# Altium schematic sheet UC3842测试分析.SchDoc
size 1651 x 1651 mm; SheetNumber: 13; SheetTotal: 16
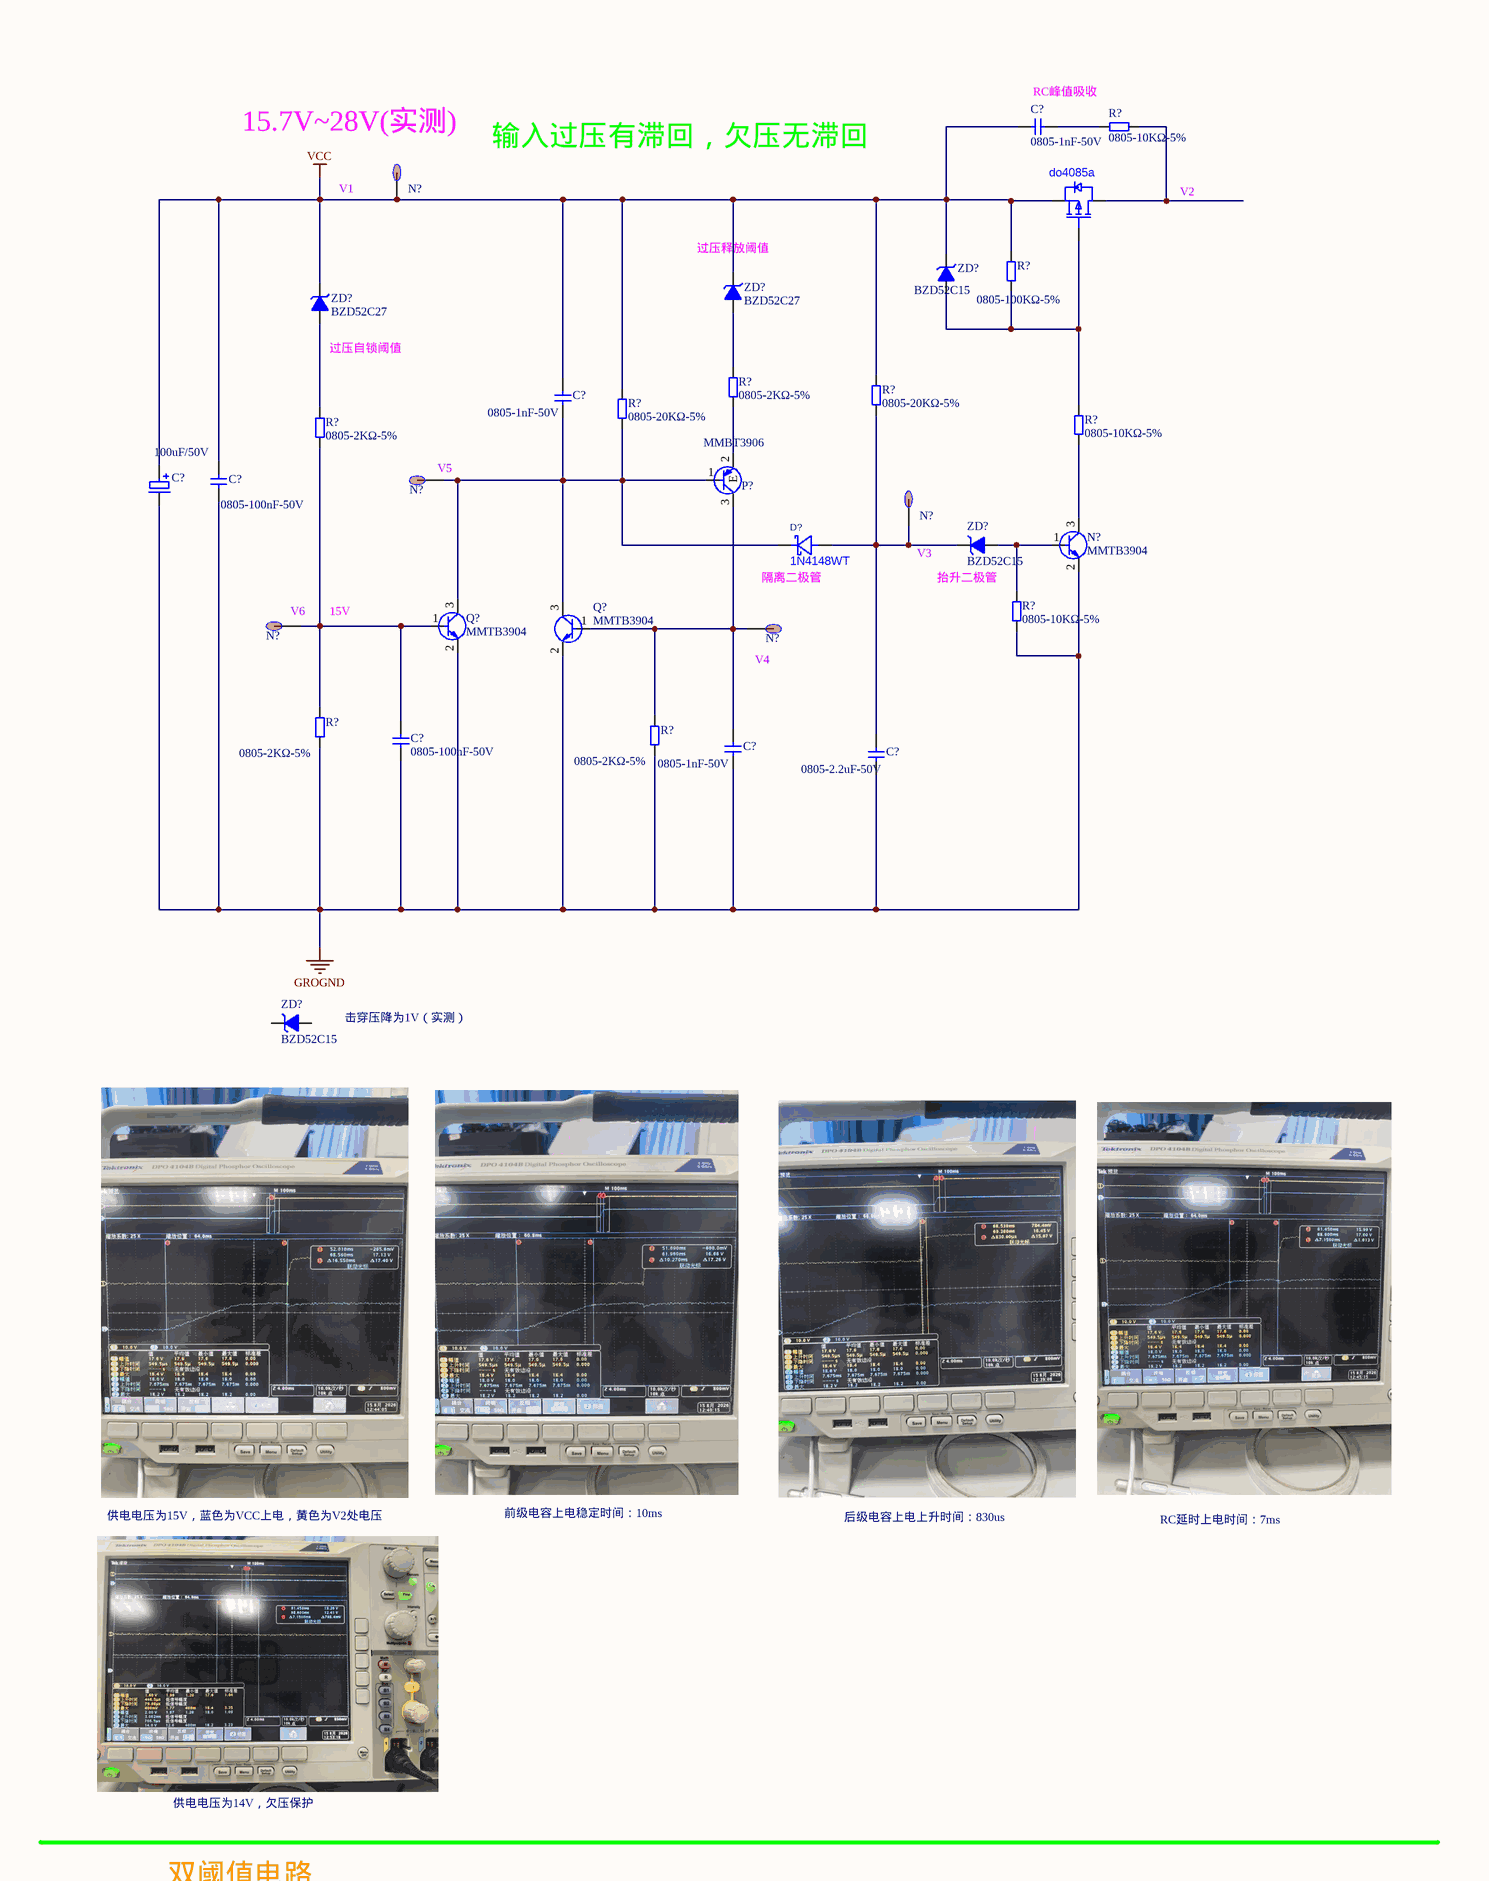
[diagram p0: UC3842测试分析.SchDoc, row 1 of 4 left]
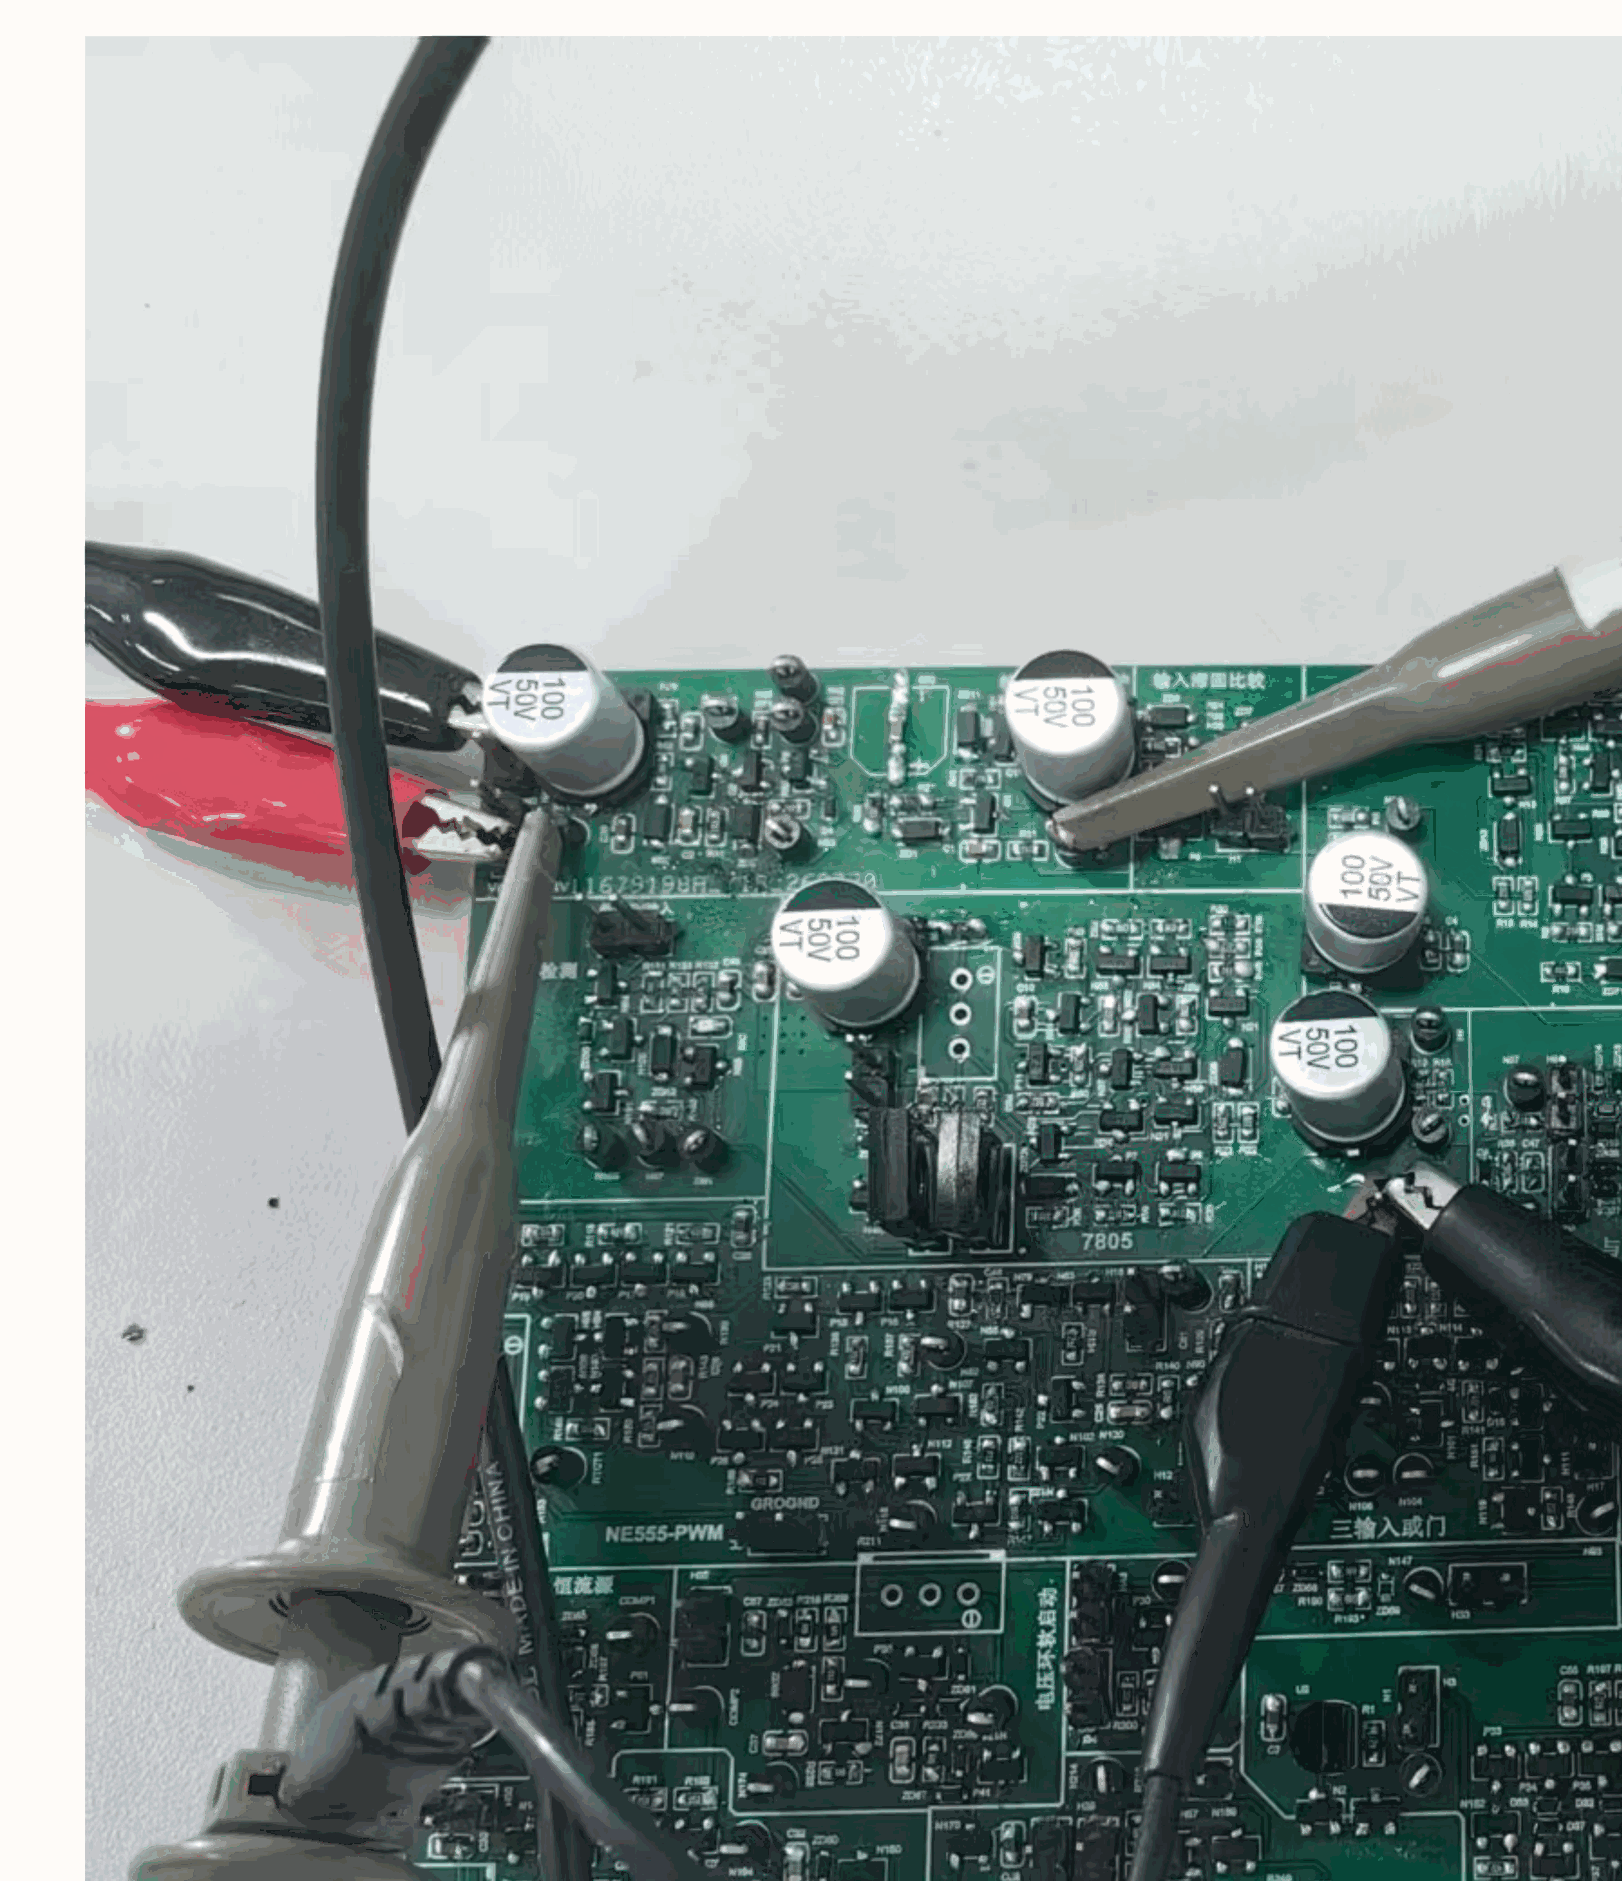
[diagram p1: UC3842测试分析.SchDoc, row 1 of 4 middle]
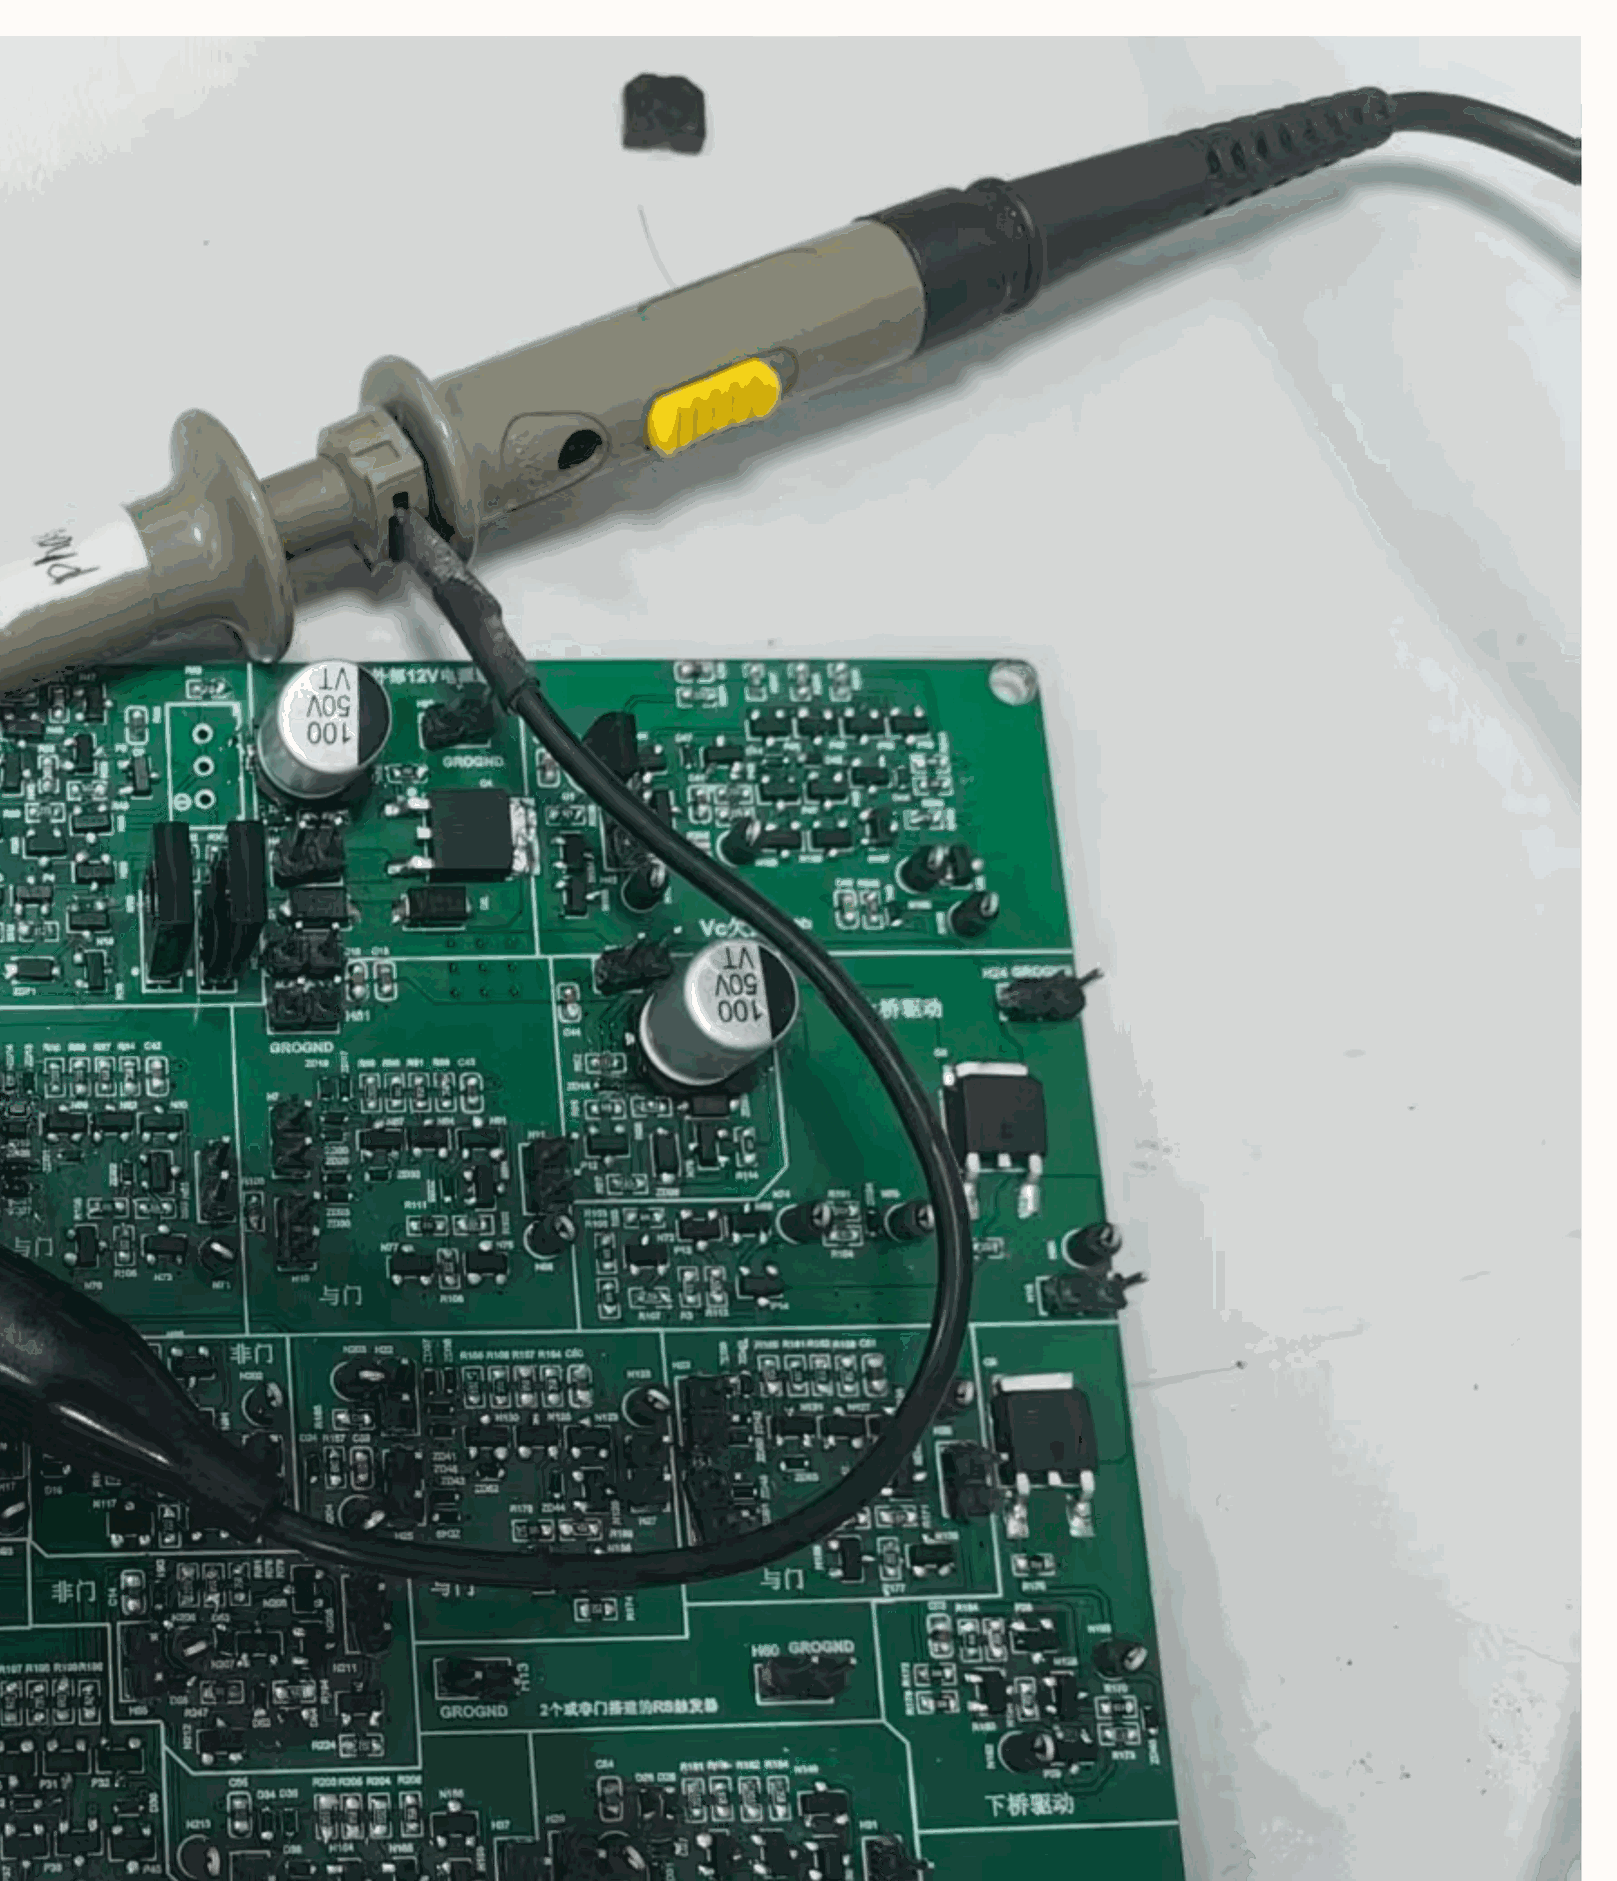
[diagram p2: UC3842测试分析.SchDoc, row 1 of 4 right]
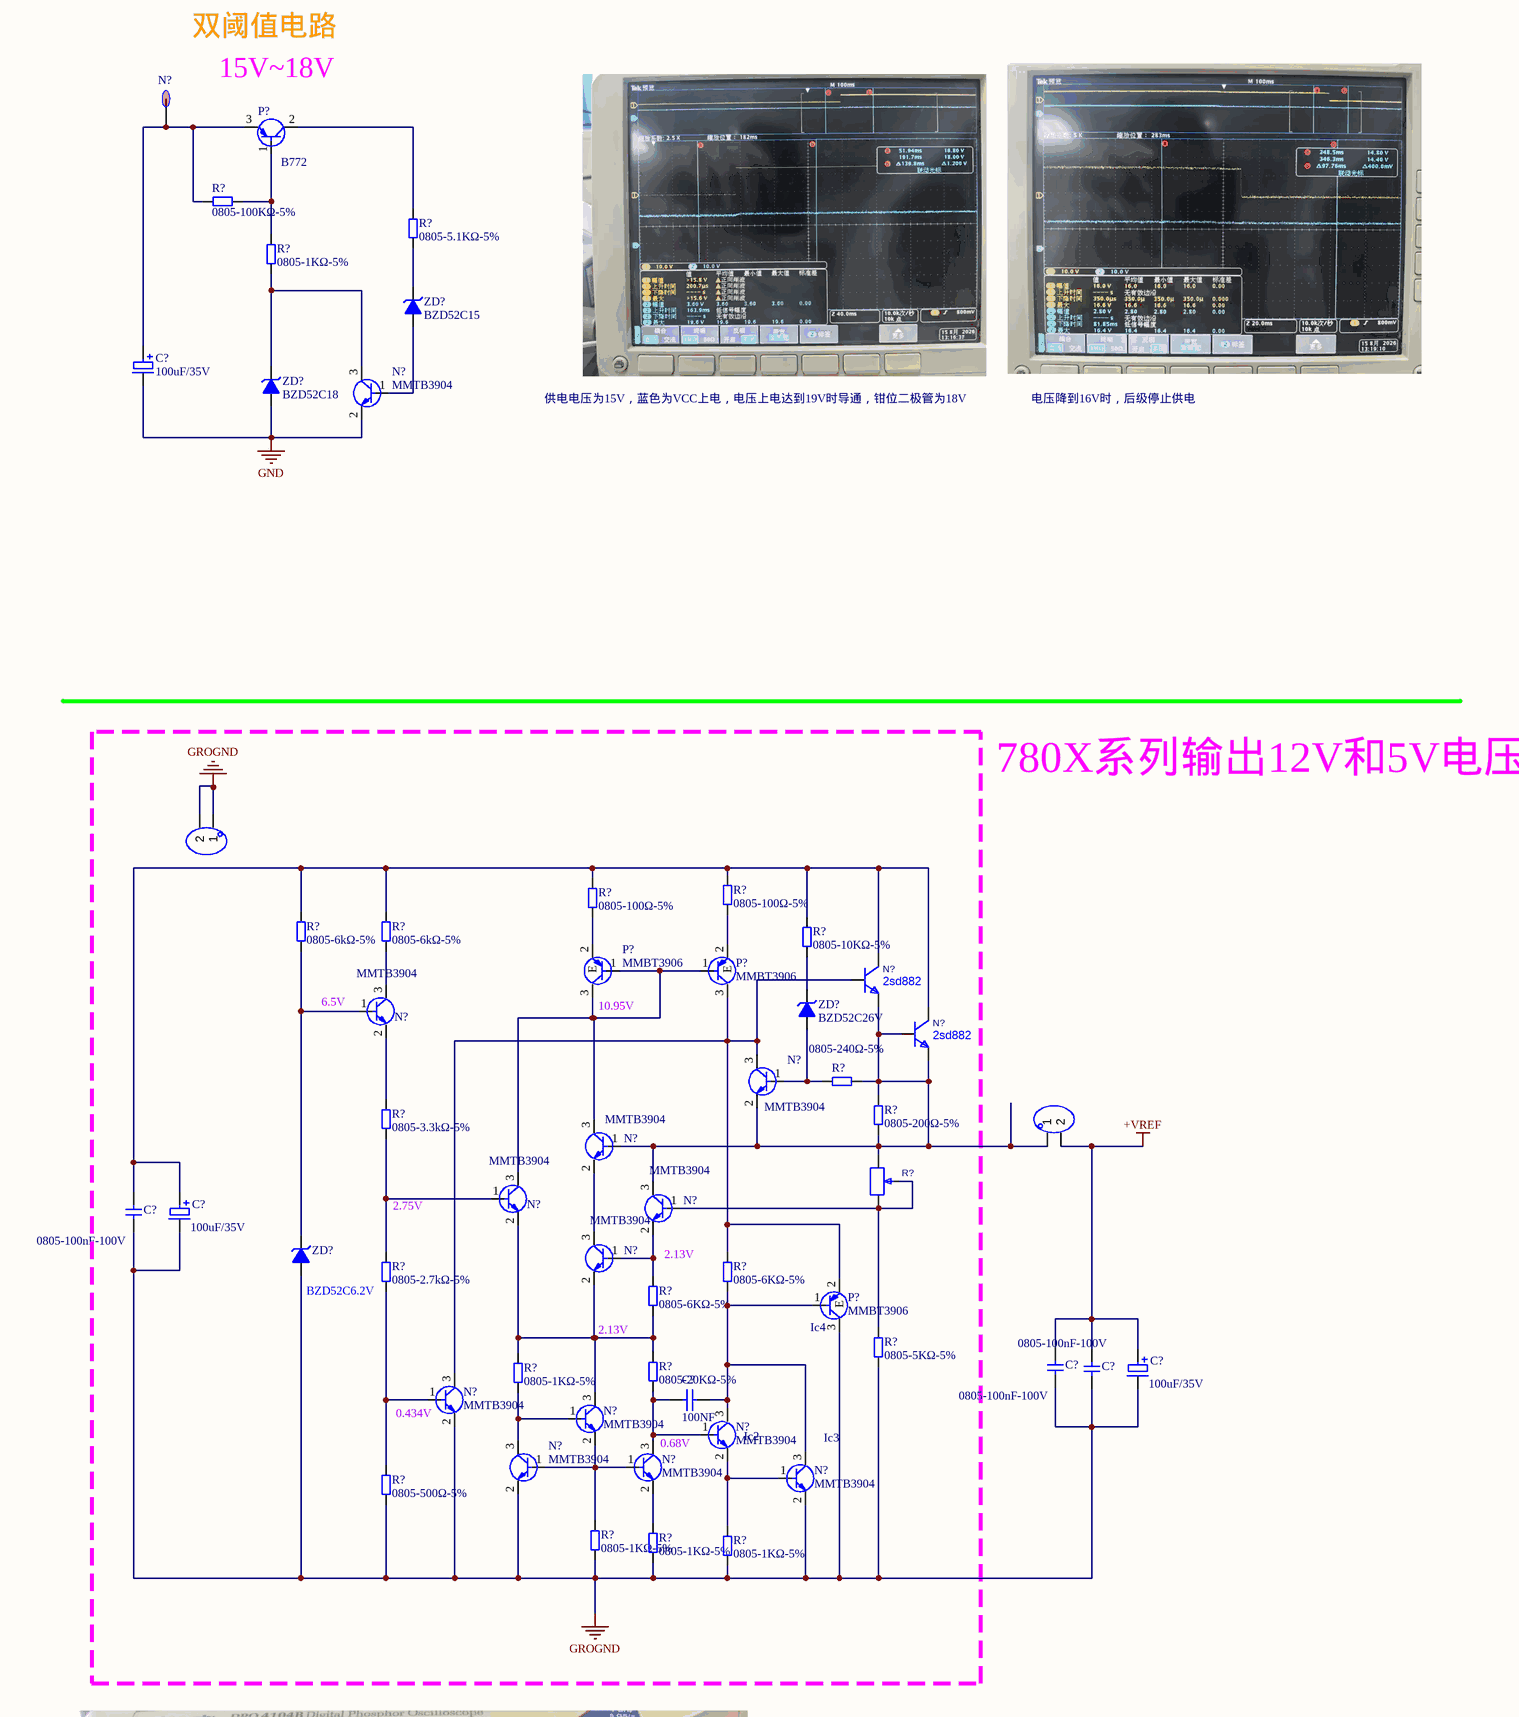
[diagram p3: UC3842测试分析.SchDoc, row 2 of 4 left]
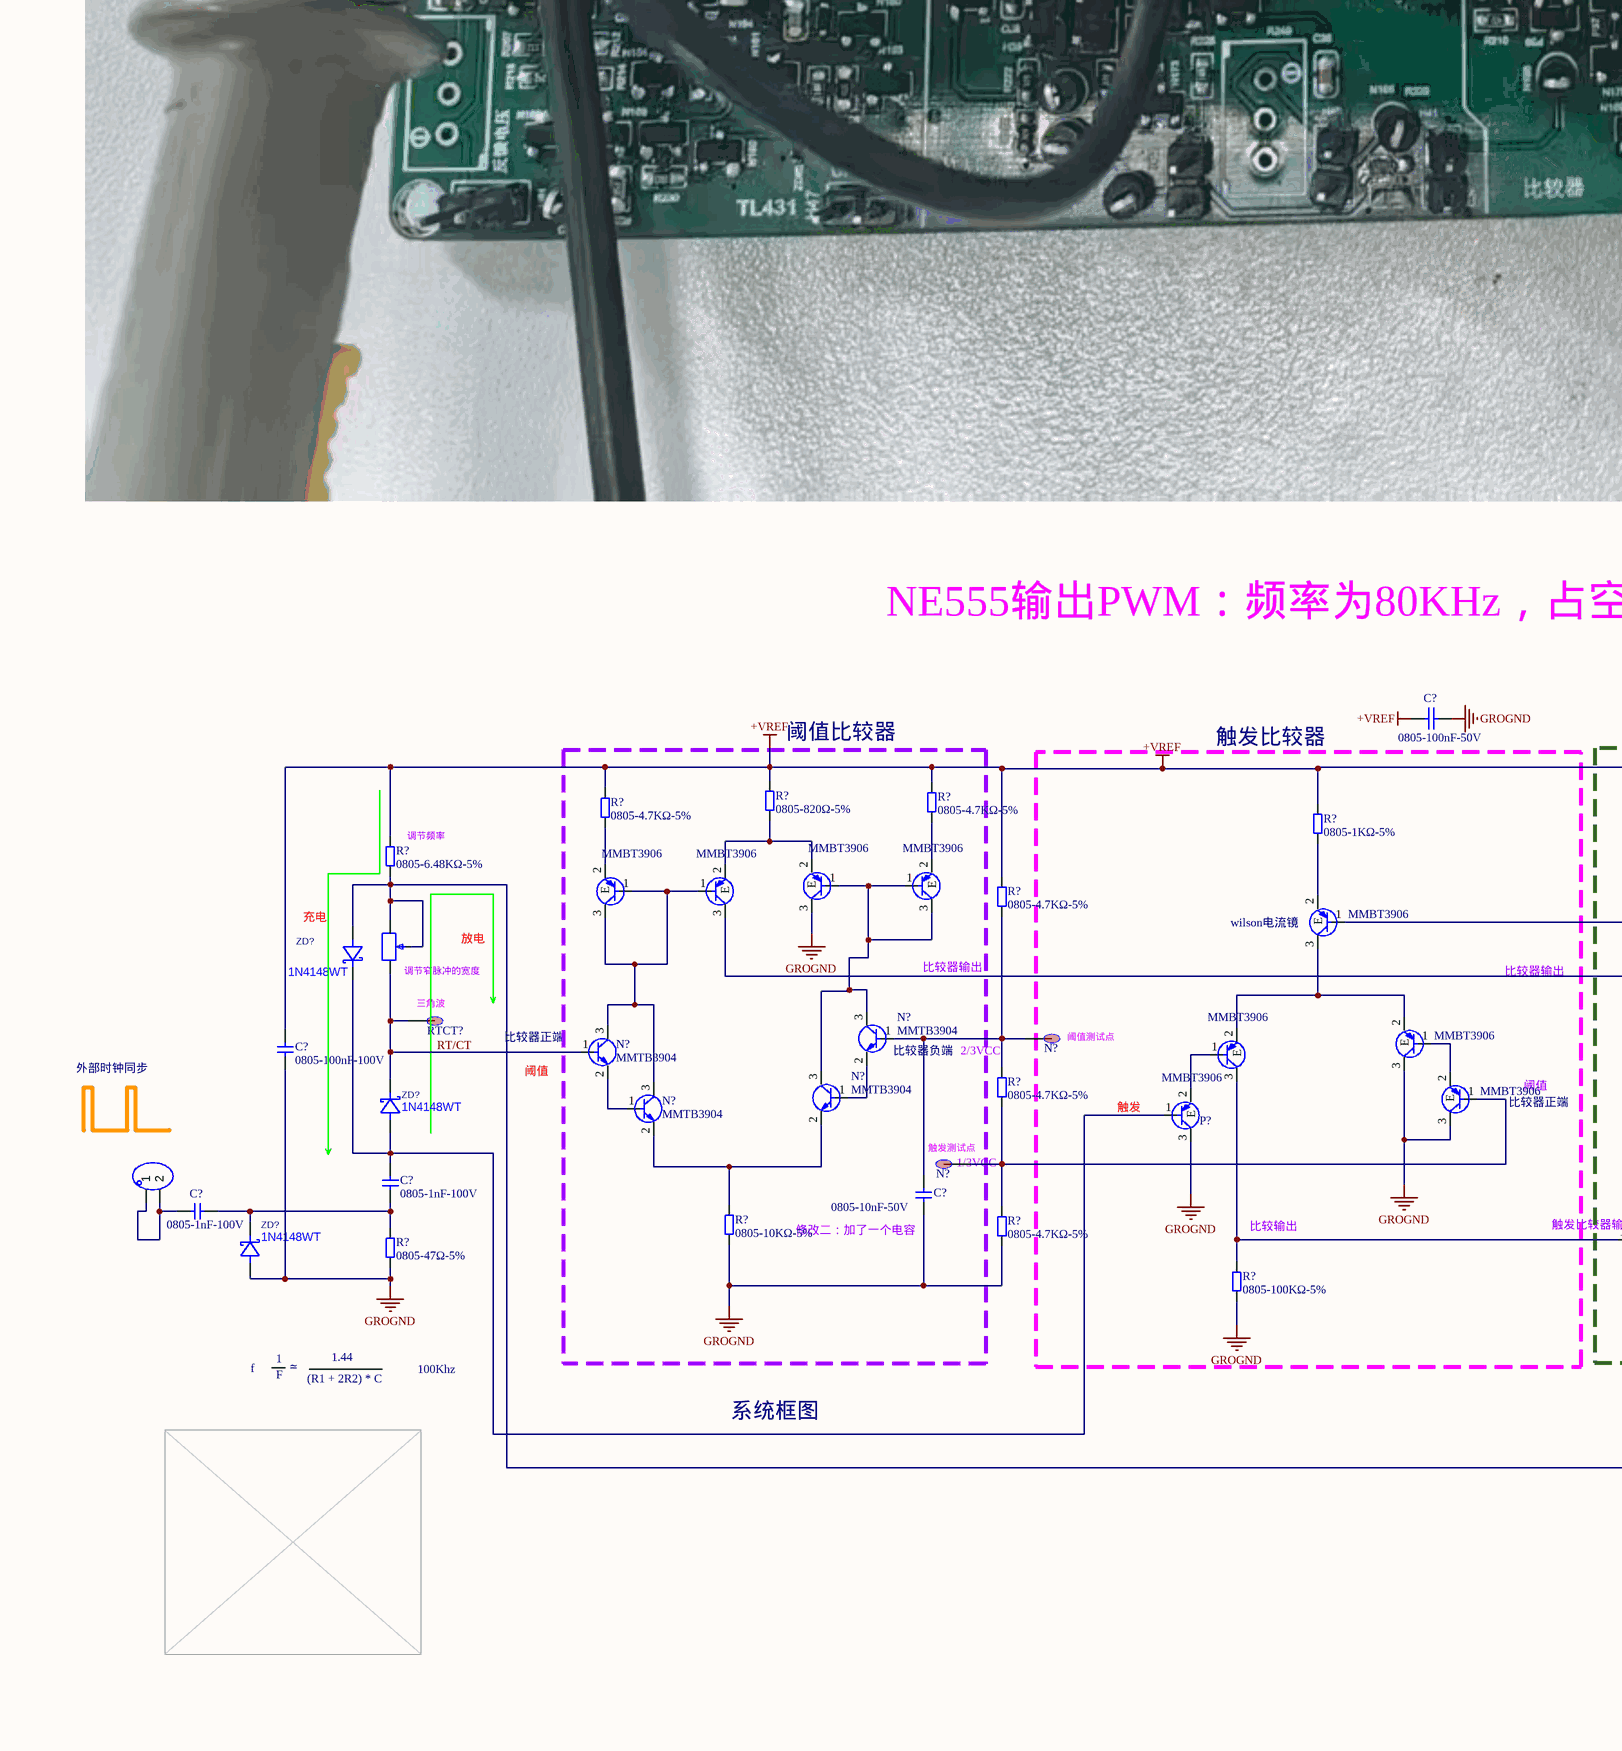
[diagram p4: UC3842测试分析.SchDoc, row 2 of 4 middle]
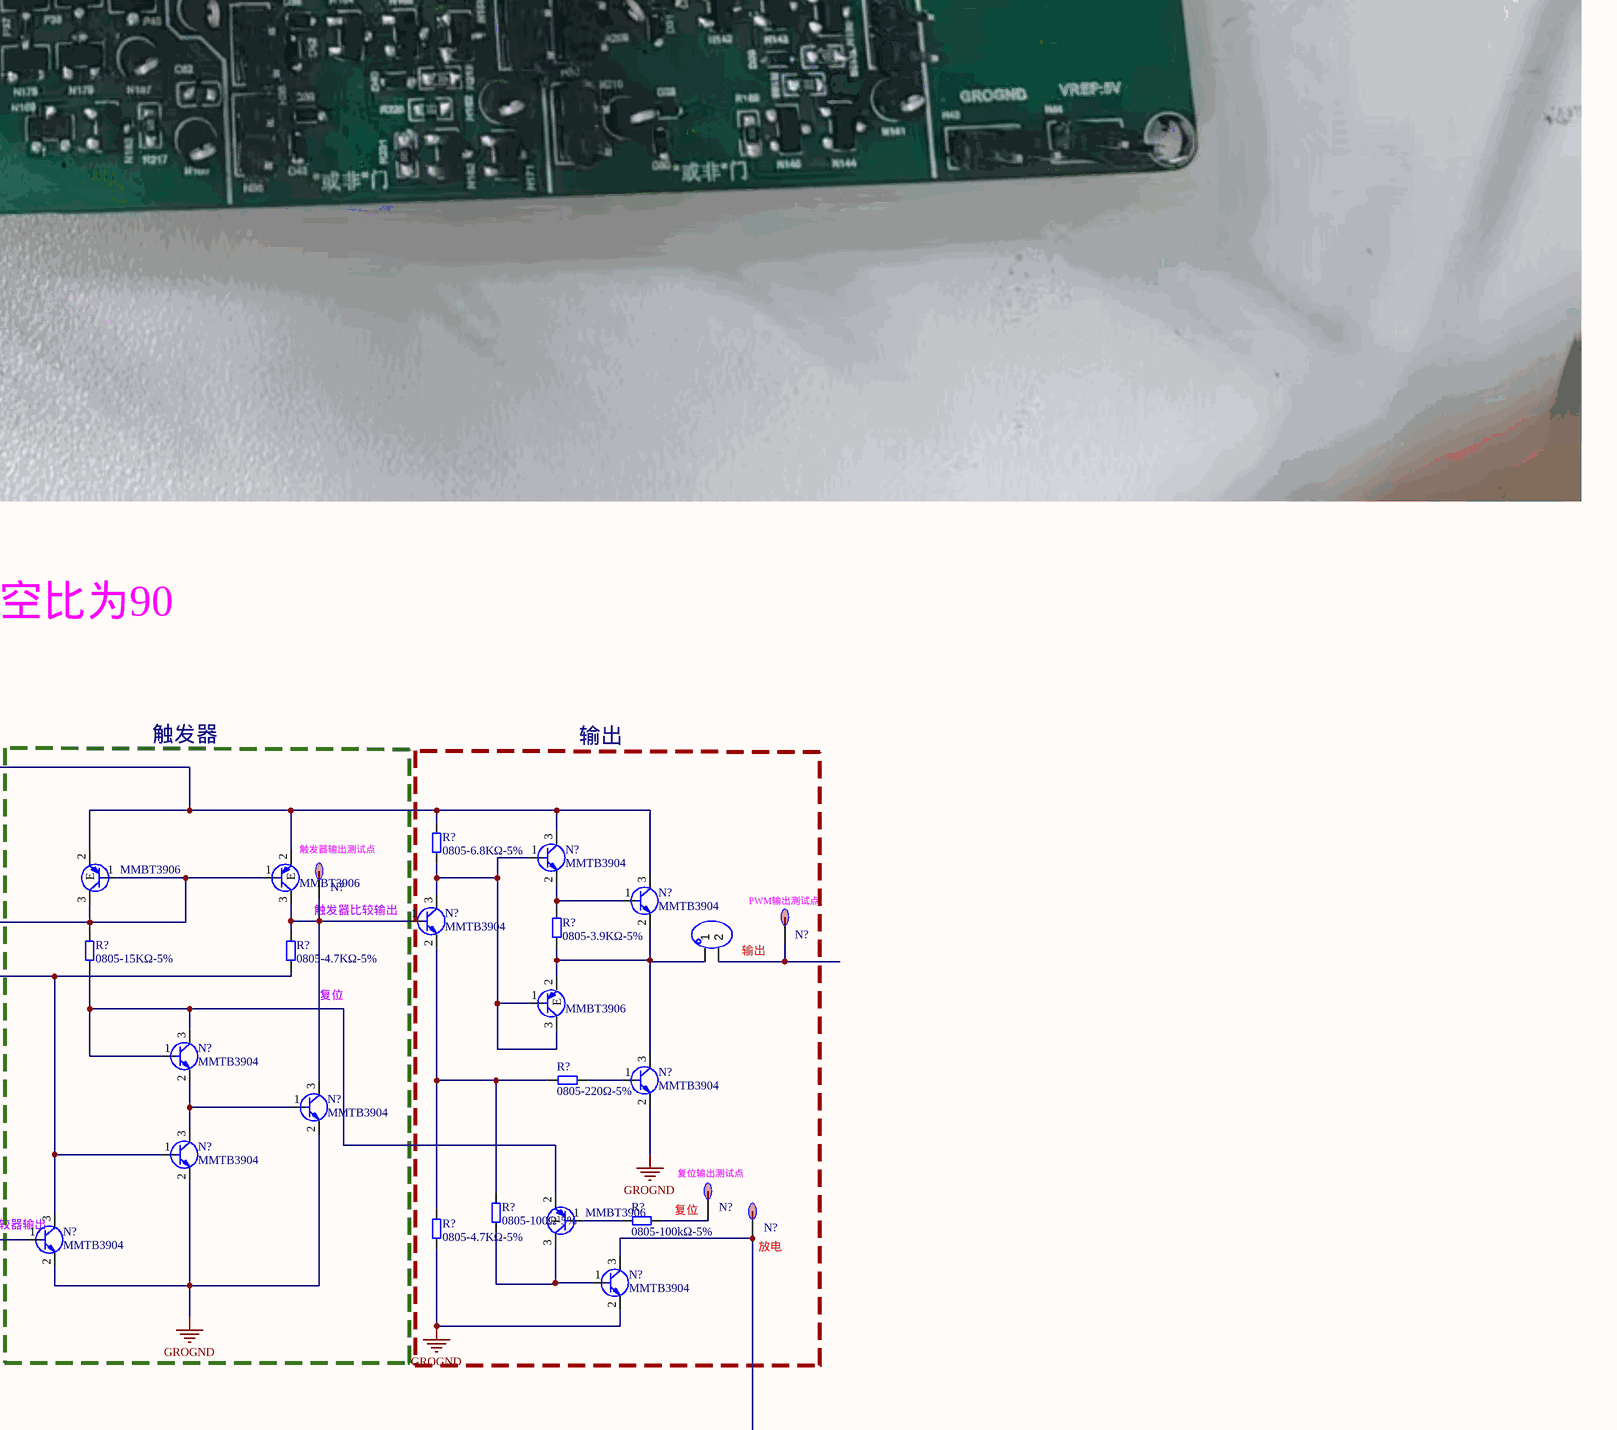
[diagram p5: UC3842测试分析.SchDoc, row 2 of 4 right]
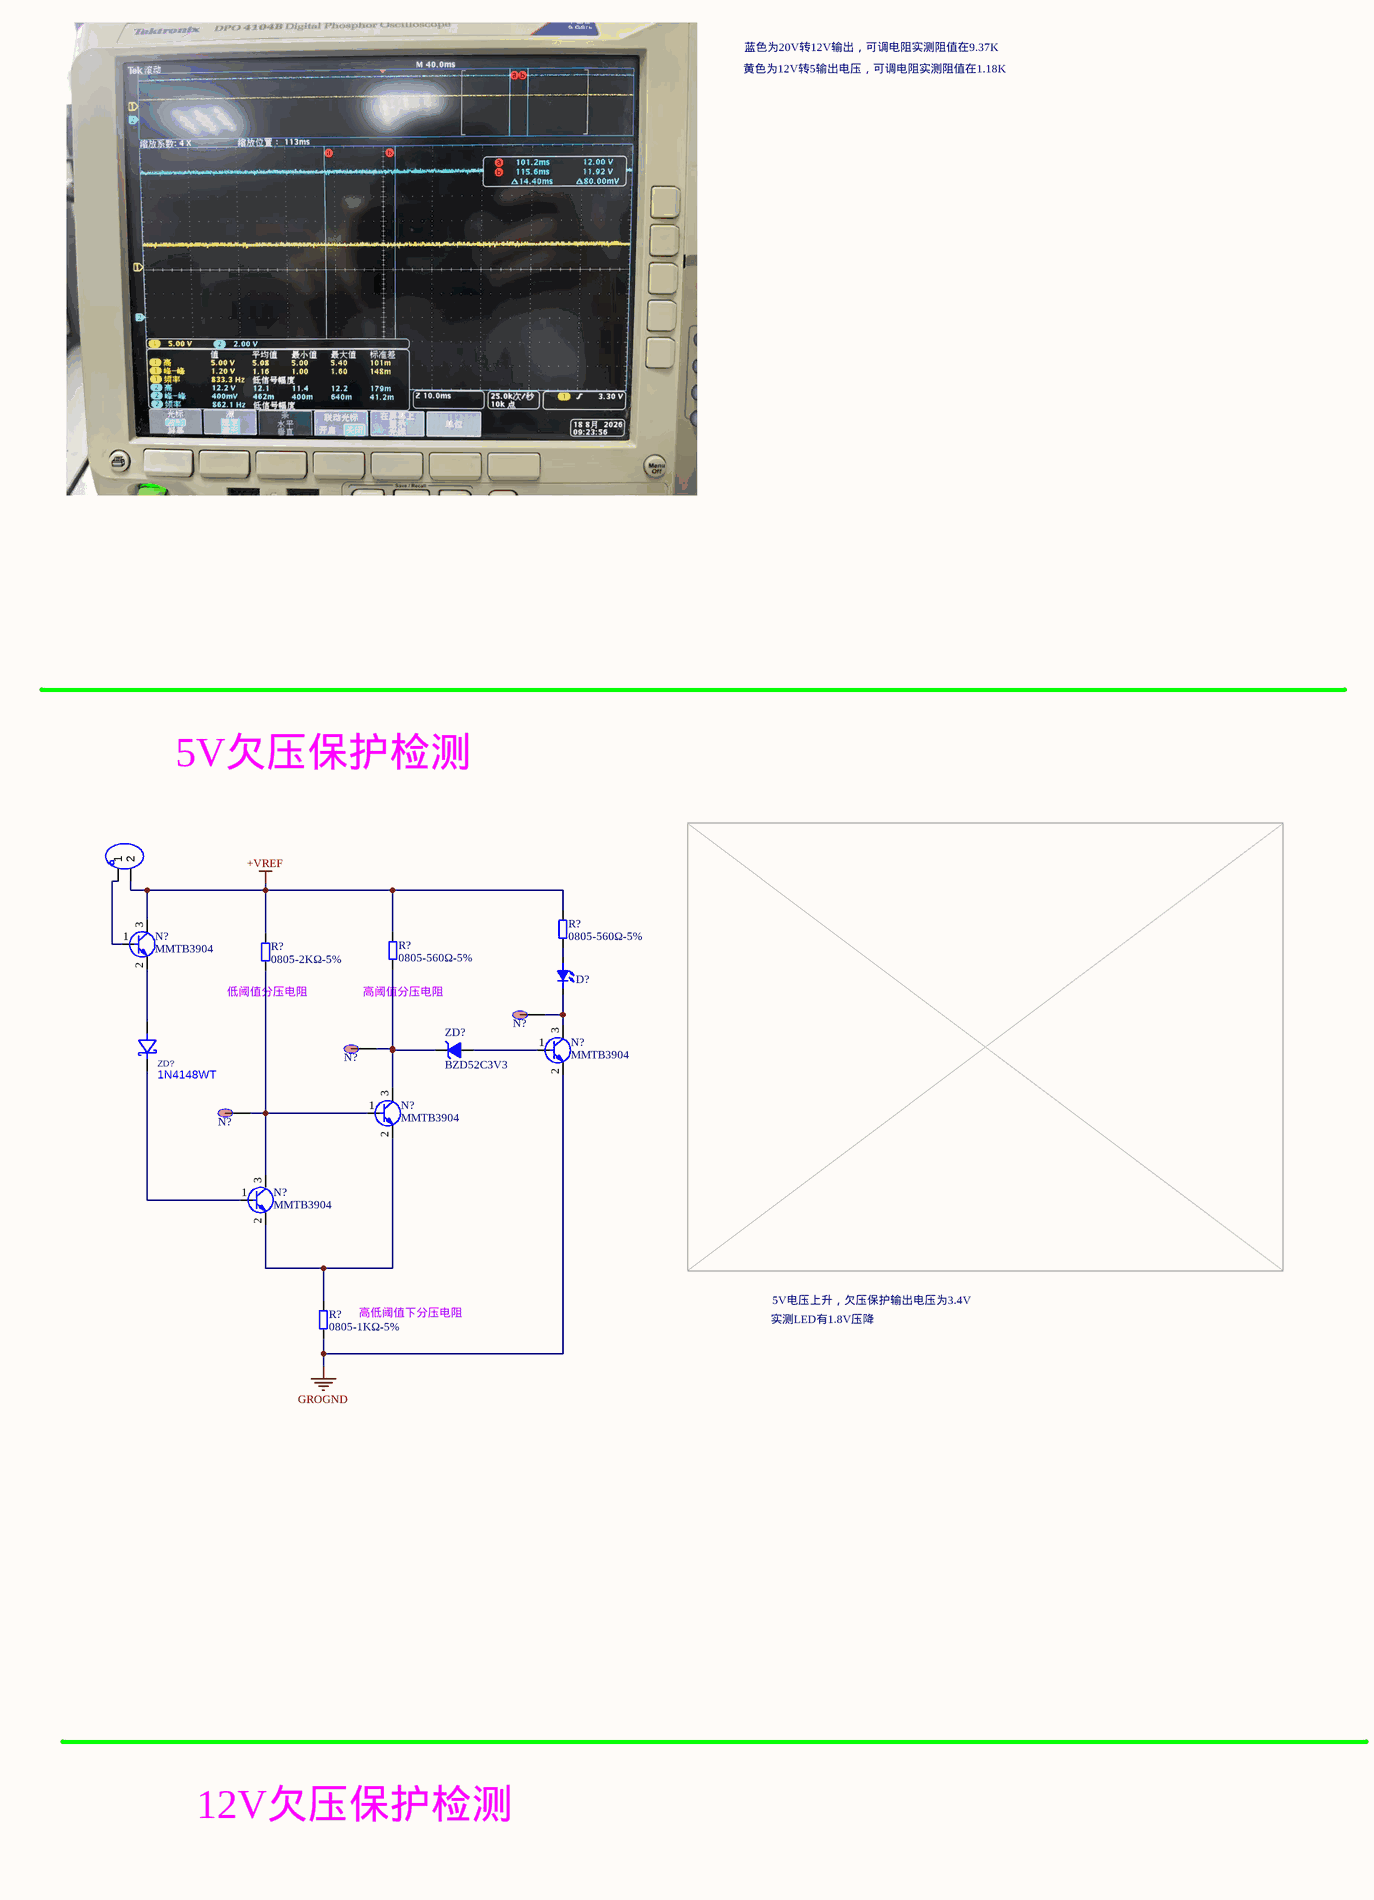
[diagram p6: UC3842测试分析.SchDoc, row 3 of 4 left]
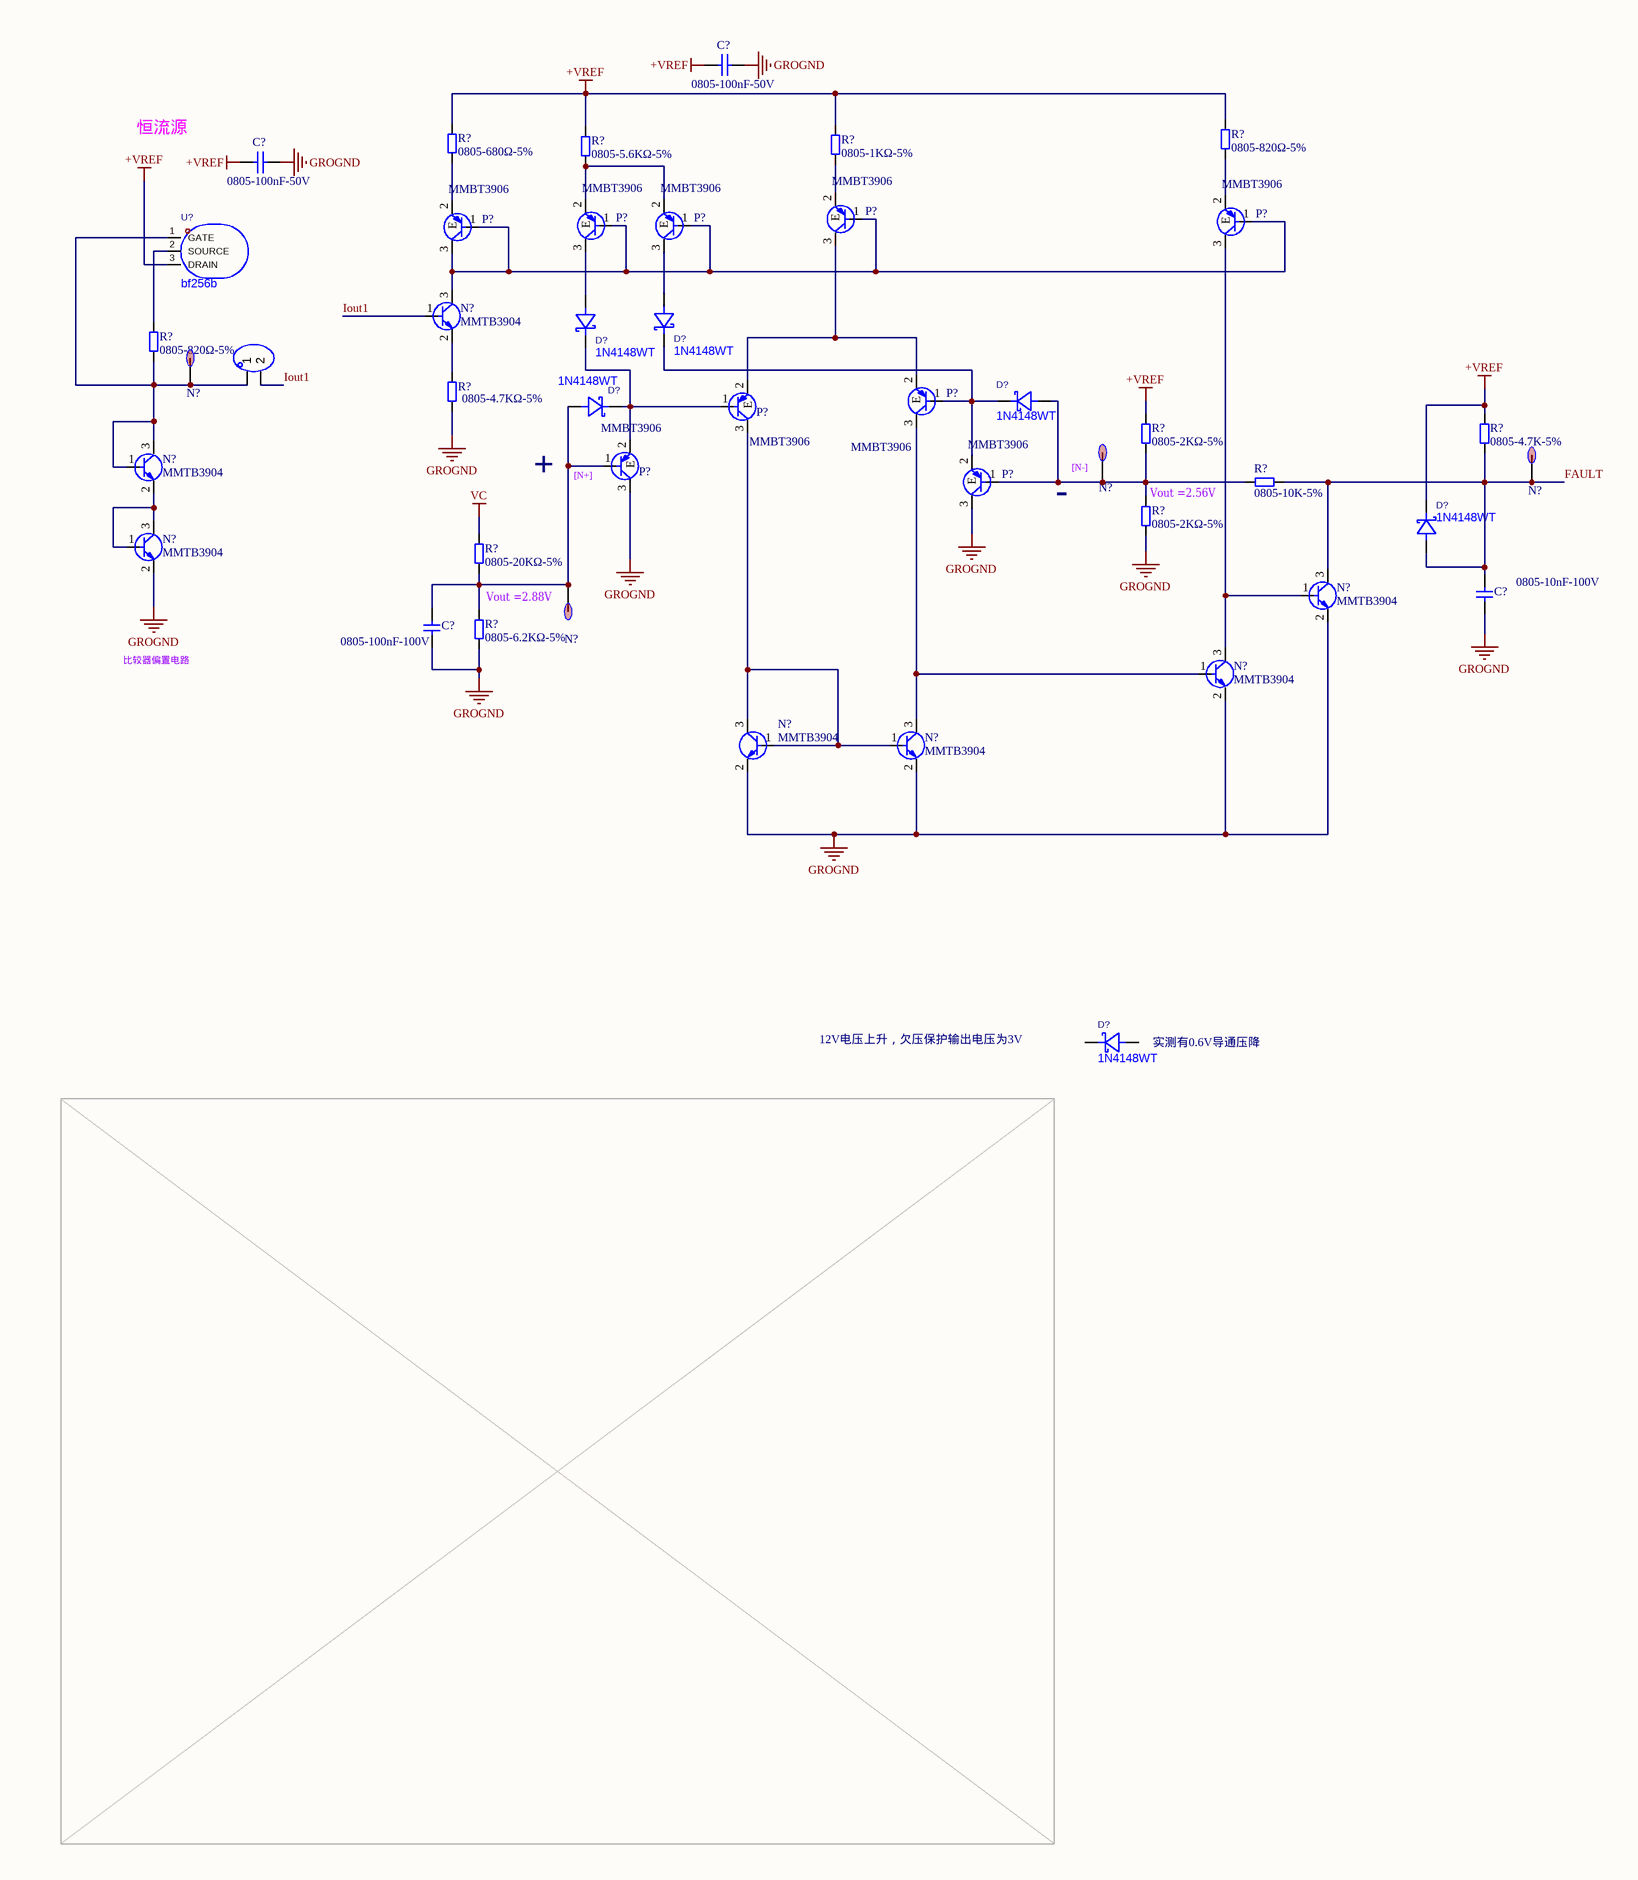
[diagram p7: UC3842测试分析.SchDoc, row 4 of 4 left]

## Parts
(Parts that share a designator on the sheet are numbered #1, #2 ... from top to bottom, then left to right.)
C?#1  0805-1nF-50V  [C0603]
C?#2  0805-1nF-50V  [C0603]
C?#3  100uF/50V  [CAP-SMD_BD6.3-L6.6-W6.6-LS7.6-FD]
C?#4  0805-100nF-50V  [C0603]
C?#5  0805-100nF-50V  [C0603]
C?#6  0805-1nF-50V  [C0603]
C?#7  0805-2.2uF-50V  [C0603]
C?#8  100uF/35V  [CAP-SMD_BD6.3-L6.6-W6.6-LS7.6-FD]
C?#9  0805-100nF-50V  [C0603]
C?#10  0805-100nF-100V  [C0603]
C?#11  0805-1nF-100V  [C0603]
C?#12  0805-10nF-50V  [C0603]
C?#13  0805-100nF-100V  [C0603]
C?#14  100uF/35V  [CAP-SMD_BD6.3-L6.6-W6.6-LS7.6-FD]
C?#15  0805-1nF-100V  [C0603]
C?#16  0805-100nF-100V  [C0603]
C?#17  100uF/35V  [CAP-SMD_BD6.3-L6.6-W6.6-LS7.6-FD]
C?#18  0805-100nF-100V  [C0603]
C?#19  100NF  [C0603]
C?#20  0805-100nF-50V  [C0603]
C?#21  0805-100nF-50V  [C0603]
C?#22  0805-10nF-100V  [C0603]
C?#23  0805-100nF-100V  [C0603]
D?#1  1N4148WT  [SOD-523_L1.2-W0.8-LS1.6-FD]
D?#2  DIO_LED  [LED0603-RD_RED]  (value not drawn)
D?#3  1N4148WT  [SOD-523_L1.2-W0.8-LS1.6-FD]
D?#4  1N4148WT  [SOD-523_L1.2-W0.8-LS1.6-FD]
D?#5  1N4148WT  [SOD-523_L1.2-W0.8-LS1.6-FD]
D?#6  1N4148WT  [SOD-523_L1.2-W0.8-LS1.6-FD]
D?#7  1N4148WT  [SOD-523_L1.2-W0.8-LS1.6-FD]
D?#8  1N4148WT  [SOD-523_L1.2-W0.8-LS1.6-FD]
H?#1  pz254v-11-02p  [HDR-TH_2P-P2.54-V-M]  (value not drawn)
H?#2  pz254v-11-02p  [HDR-TH_2P-P2.54-V-M]  (value not drawn)
H?#3  pz254v-11-02p  [HDR-TH_2P-P2.54-V-M]  (value not drawn)
H?#4  pz254v-11-02p  [HDR-TH_2P-P2.54-V-M]  (value not drawn)
H?#5  pz254v-11-02p  [HDR-TH_2P-P2.54-V-M]  (value not drawn)
H?#6  pz254v-11-02p  [HDR-TH_2P-P2.54-V-M]  (value not drawn)
N?#1  (no value)  [TEST-TH_BD2.54-P1.4_RED]
N?#2  (no value)  [TEST-TH_BD2.54-P1.4_RED]
N?#3  (no value)  [TEST-TH_BD2.54-P1.4_RED]
N?#4  MMTB3904  [SOT-23-3_L2.9-W1.3-P1.90-LS2.4-BR - duplicate]
N?#5  (no value)  [TEST-TH_BD2.54-P1.4_RED]
N?#6  (no value)  [TEST-TH_BD2.54-P1.4_RED]
N?#7  (no value)  [TEST-TH_BD2.54-P1.4_RED]
N?#8  MMTB3904  [SOT-23-3_L2.9-W1.3-P1.90-LS2.4-BR - duplicate]
N?#9  MMTB3904  [SOT-23-3_L2.9-W1.3-P1.90-LS2.4-BR - duplicate]
N?#10  (no value)  [TEST-TH_BD2.54-P1.4_RED]
N?#11  MMTB3904  [SOT-23-3_L2.9-W1.3-P1.90-LS2.4-BR - duplicate]
N?#12  MMTB3904  [SOT-23-3_L2.9-W1.3-P1.90-LS2.4-BR - duplicate]
N?#13  (no value)  [TEST-TH_BD2.54-P1.4_RED]
N?#14  2sd882  [TO-126-3_L7.6-W2.7-P2.29-R]
N?#15  MMTB3904  [SOT-23-3_L2.9-W1.3-P1.90-LS2.4-BR - duplicate]
N?#16  2sd882  [TO-126-3_L7.6-W2.7-P2.29-R]
N?#17  MMTB3904  [SOT-23-3_L2.9-W1.3-P1.90-LS2.4-BR - duplicate]
N?#18  (no value)  [TEST-TH_BD2.54-P1.4_RED]
N?#19  MMTB3904  [SOT-23-3_L2.9-W1.3-P1.90-LS2.4-BR - duplicate]
N?#20  MMTB3904  [SOT-23-3_L2.9-W1.3-P1.90-LS2.4-BR - duplicate]
N?#21  MMTB3904  [SOT-23-3_L2.9-W1.3-P1.90-LS2.4-BR - duplicate]
N?#22  MMTB3904  [SOT-23-3_L2.9-W1.3-P1.90-LS2.4-BR - duplicate]
N?#23  MMTB3904  [SOT-23-3_L2.9-W1.3-P1.90-LS2.4-BR - duplicate]
N?#24  MMTB3904  [SOT-23-3_L2.9-W1.3-P1.90-LS2.4-BR - duplicate]
N?#25  MMTB3904  [SOT-23-3_L2.9-W1.3-P1.90-LS2.4-BR - duplicate]
N?#26  MMTB3904  [SOT-23-3_L2.9-W1.3-P1.90-LS2.4-BR - duplicate]
N?#27  MMTB3904  [SOT-23-3_L2.9-W1.3-P1.90-LS2.4-BR - duplicate]
N?#28  (no value)  [TEST-TH_BD2.54-P1.4_RED]
N?#29  MMTB3904  [SOT-23-3_L2.9-W1.3-P1.90-LS2.4-BR - duplicate]
N?#30  MMTB3904  [SOT-23-3_L2.9-W1.3-P1.90-LS2.4-BR - duplicate]
N?#31  (no value)  [TEST-TH_BD2.54-P1.4_RED]
N?#32  MMTB3904  [SOT-23-3_L2.9-W1.3-P1.90-LS2.4-BR - duplicate]
N?#33  (no value)  [TEST-TH_BD2.54-P1.4_RED]
N?#34  MMTB3904  [SOT-23-3_L2.9-W1.3-P1.90-LS2.4-BR - duplicate]
N?#35  MMTB3904  [SOT-23-3_L2.9-W1.3-P1.90-LS2.4-BR - duplicate]
N?#36  MMTB3904  [SOT-23-3_L2.9-W1.3-P1.90-LS2.4-BR - duplicate]
N?#37  MMTB3904  [SOT-23-3_L2.9-W1.3-P1.90-LS2.4-BR - duplicate]
N?#38  MMTB3904  [SOT-23-3_L2.9-W1.3-P1.90-LS2.4-BR - duplicate]
N?#39  MMTB3904  [SOT-23-3_L2.9-W1.3-P1.90-LS2.4-BR - duplicate]
N?#40  MMTB3904  [SOT-23-3_L2.9-W1.3-P1.90-LS2.4-BR - duplicate]
N?#41  MMTB3904  [SOT-23-3_L2.9-W1.3-P1.90-LS2.4-BR - duplicate]
N?#42  MMTB3904  [SOT-23-3_L2.9-W1.3-P1.90-LS2.4-BR - duplicate]
N?#43  (no value)  [TEST-TH_BD2.54-P1.4_RED]
N?#44  (no value)  [TEST-TH_BD2.54-P1.4_RED]
N?#45  MMTB3904  [SOT-23-3_L2.9-W1.3-P1.90-LS2.4-BR - duplicate]
N?#46  (no value)  [TEST-TH_BD2.54-P1.4_RED]
N?#47  MMTB3904  [SOT-23-3_L2.9-W1.3-P1.90-LS2.4-BR - duplicate]
N?#48  MMTB3904  [SOT-23-3_L2.9-W1.3-P1.90-LS2.4-BR - duplicate]
N?#49  MMTB3904  [SOT-23-3_L2.9-W1.3-P1.90-LS2.4-BR - duplicate]
N?#50  (no value)  [TEST-TH_BD2.54-P1.4_RED]
N?#51  MMTB3904  [SOT-23-3_L2.9-W1.3-P1.90-LS2.4-BR - duplicate]
N?#52  (no value)  [TEST-TH_BD2.54-P1.4_RED]
N?#53  (no value)  [TEST-TH_BD2.54-P1.4_RED]
N?#54  MMTB3904  [SOT-23-3_L2.9-W1.3-P1.90-LS2.4-BR - duplicate]
N?#55  (no value)  [TEST-TH_BD2.54-P1.4_RED]
N?#56  MMTB3904  [SOT-23-3_L2.9-W1.3-P1.90-LS2.4-BR - duplicate]
N?#57  MMTB3904  [SOT-23-3_L2.9-W1.3-P1.90-LS2.4-BR - duplicate]
N?#58  MMTB3904  [SOT-23-3_L2.9-W1.3-P1.90-LS2.4-BR - duplicate]
N?#59  MMTB3904  [SOT-23-3_L2.9-W1.3-P1.90-LS2.4-BR - duplicate]
P?#1  MMBT3906  [SOT-23-3_L2.9-W1.3-P1.90-LS2.4-BR]
P?#2  B772  [SOT-89-3_L4.5-W2.5-P1.50-LS4.2-BR]
P?#3  MMBT3906  [SOT-23-3_L2.9-W1.3-P1.90-LS2.4-BR]
P?#4  MMBT3906  [SOT-23-3_L2.9-W1.3-P1.90-LS2.4-BR]
P?#5  MMBT3906  [SOT-23-3_L2.9-W1.3-P1.90-LS2.4-BR]
P?#6  MMBT3906  [SOT-23-3_L2.9-W1.3-P1.90-LS2.4-BR]
P?#7  MMBT3906  [SOT-23-3_L2.9-W1.3-P1.90-LS2.4-BR]
P?#8  MMBT3906  [SOT-23-3_L2.9-W1.3-P1.90-LS2.4-BR]
P?#9  MMBT3906  [SOT-23-3_L2.9-W1.3-P1.90-LS2.4-BR]
P?#10  MMBT3906  [SOT-23-3_L2.9-W1.3-P1.90-LS2.4-BR]
P?#11  MMBT3906  [SOT-23-3_L2.9-W1.3-P1.90-LS2.4-BR]
P?#12  MMBT3906  [SOT-23-3_L2.9-W1.3-P1.90-LS2.4-BR]
P?#13  MMBT3906  [SOT-23-3_L2.9-W1.3-P1.90-LS2.4-BR]
P?#14  MMBT3906  [SOT-23-3_L2.9-W1.3-P1.90-LS2.4-BR]
P?#15  MMBT3906  [SOT-23-3_L2.9-W1.3-P1.90-LS2.4-BR]
P?#16  MMBT3906  [SOT-23-3_L2.9-W1.3-P1.90-LS2.4-BR]
P?#17  MMBT3906  [SOT-23-3_L2.9-W1.3-P1.90-LS2.4-BR]
P?#18  MMBT3906  [SOT-23-3_L2.9-W1.3-P1.90-LS2.4-BR]
P?#19  MMBT3906  [SOT-23-3_L2.9-W1.3-P1.90-LS2.4-BR]
P?#20  MMBT3906  [SOT-23-3_L2.9-W1.3-P1.90-LS2.4-BR]
P?#21  MMBT3906  [SOT-23-3_L2.9-W1.3-P1.90-LS2.4-BR]
P?#22  MMBT3906  [SOT-23-3_L2.9-W1.3-P1.90-LS2.4-BR]
P?#23  MMBT3906  [SOT-23-3_L2.9-W1.3-P1.90-LS2.4-BR]
P?#24  MMBT3906  [SOT-23-3_L2.9-W1.3-P1.90-LS2.4-BR]
P?#25  MMBT3906  [SOT-23-3_L2.9-W1.3-P1.90-LS2.4-BR]
P?#26  MMBT3906  [SOT-23-3_L2.9-W1.3-P1.90-LS2.4-BR]
P?#27  MMBT3906  [SOT-23-3_L2.9-W1.3-P1.90-LS2.4-BR]
Q?#1  do4085a  [SOT-23-3_L2.9-W1.6-P1.90-LS2.8-BR]
Q?#2  MMTB3904  [SOT-23-3_L2.9-W1.3-P1.90-LS2.4-BR - duplicate]
Q?#3  MMTB3904  [SOT-23-3_L2.9-W1.3-P1.90-LS2.4-BR - duplicate]
R?#1  0805-10KΩ-5%  [R0603]
R?#2  0805-100KΩ-5%  [R0603]
R?#3  0805-2KΩ-5%  [R0603]
R?#4  0805-20KΩ-5%  [R0603]
R?#5  0805-20KΩ-5%  [R0603]
R?#6  0805-10KΩ-5%  [R0603]
R?#7  0805-2KΩ-5%  [R0603]
R?#8  0805-10KΩ-5%  [R0603]
R?#9  0805-2KΩ-5%  [R0603]
R?#10  0805-2KΩ-5%  [R0603]
R?#11  0805-100KΩ-5%  [R0603]
R?#12  0805-5.1KΩ-5%  [R0603]
R?#13  0805-1KΩ-5%  [R0603]
R?#14  0805-820Ω-5%  [R0603]
R?#15  0805-4.7KΩ-5%  [R0603]
R?#16  0805-4.7KΩ-5%  [R0603]
R?#17  0805-1KΩ-5%  [R0603]
R?#18  0805-6.8KΩ-5%  [R0603]
R?#19  0805-6.48KΩ-5%  [R0603]
R?#20  0805-100Ω-5%  [R0603]
R?#21  0805-100Ω-5%  [R0603]
R?#22  0805-4.7KΩ-5%  [R0603]
R?#23  3296w-1-202lf  [RES-ADJ-TH_3296W]  (value not drawn)
R?#24  0805-6kΩ-5%  [R0603]
R?#25  0805-6kΩ-5%  [R0603]
R?#26  0805-3.9KΩ-5%  [R0603]
R?#27  0805-10KΩ-5%  [R0603]
R?#28  0805-15KΩ-5%  [R0603]
R?#29  0805-4.7KΩ-5%  [R0603]
R?#30  0805-240Ω-5%  [R0603]
R?#31  0805-220Ω-5%  [R0603]
R?#32  0805-200Ω-5%  [R0603]
R?#33  0805-4.7KΩ-5%  [R0603]
R?#34  0805-3.3kΩ-5%  [R0603]
R?#35  3296w-1-202lf  [RES-ADJ-TH_3296W]  (value not drawn)
R?#36  0805-100kΩ-5%  [R0603]
R?#37  0805-100Ω-5%  [R0603]
R?#38  0805-10KΩ-5%  [R0603]
R?#39  0805-4.7KΩ-5%  [R0603]
R?#40  0805-4.7KΩ-5%  [R0603]
R?#41  0805-47Ω-5%  [R0603]
R?#42  0805-2.7kΩ-5%  [R0603]
R?#43  0805-6KΩ-5%  [R0603]
R?#44  0805-100KΩ-5%  [R0603]
R?#45  0805-6KΩ-5%  [R0603]
R?#46  0805-5KΩ-5%  [R0603]
R?#47  0805-20KΩ-5%  [R0603]
R?#48  0805-1KΩ-5%  [R0603]
R?#49  0805-500Ω-5%  [R0603]
R?#50  0805-1KΩ-5%  [R0603]
R?#51  0805-1KΩ-5%  [R0603]
R?#52  0805-1KΩ-5%  [R0603]
R?#53  0805-560Ω-5%  [R0603]
R?#54  0805-2KΩ-5%  [R0603]
R?#55  0805-560Ω-5%  [R0603]
R?#56  0805-1KΩ-5%  [R0603]
R?#57  0805-680Ω-5%  [R0603]
R?#58  0805-1KΩ-5%  [R0603]
R?#59  0805-820Ω-5%  [R0603]
R?#60  0805-5.6KΩ-5%  [R0603]
R?#61  0805-820Ω-5%  [R0603]
R?#62  0805-4.7KΩ-5%  [R0603]
R?#63  0805-4.7K-5%  [R0603]
R?#64  0805-2KΩ-5%  [R0603]
R?#65  0805-10K-5%  [R0603]
R?#66  0805-2KΩ-5%  [R0603]
R?#67  0805-20KΩ-5%  [R0603]
R?#68  0805-6.2KΩ-5%  [R0603]
RTCT?  (no value)  [TEST-TH_BD2.54-P1.4_RED]
U?  bf256b  [TO-92-3_L4.6-W3.9-P1.27-L]
ZD?#1  BZD52C15  [SOD-123_L2.7-W1.6-LS3.7-RD]
ZD?#2  BZD52C27  [SOD-123_L2.7-W1.6-LS3.7-RD]
ZD?#3  BZD52C27  [SOD-123_L2.7-W1.6-LS3.7-RD]
ZD?#4  BZD52C15  [SOD-123_L2.7-W1.6-LS3.7-RD]
ZD?#5  BZD52C15  [SOD-123_L2.7-W1.6-LS3.7-RD]
ZD?#6  BZD52C15  [SOD-123_L2.7-W1.6-LS3.7-RD]
ZD?#7  BZD52C18  [SOD-123_L2.7-W1.6-LS3.7-RD]
ZD?#8  1N4148WT  [SOD-523_L1.2-W0.8-LS1.6-FD]
ZD?#9  BZD52C26V  [SOD-123_L2.7-W1.6-LS3.7-RD]
ZD?#10  1N4148WT  [SOD-523_L1.2-W0.8-LS1.6-FD]
ZD?#11  1N4148WT  [SOD-523_L1.2-W0.8-LS1.6-FD]
ZD?#12  BZD52C6.2V  [SOD-123_L2.7-W1.6-LS3.7-RD]
ZD?#13  1N4148WT  [SOD-523_L1.2-W0.8-LS1.6-FD]
ZD?#14  BZD52C3V3  [SOD-123_L2.7-W1.6-LS3.7-RD]

## Blocks framed on the sheet
触发器: N?#10 N?#20 N?#25 N?#27 N?#32 P?#3 P?#4 R?#28 R?#29
阈值比较器: C?#12 N?#17 N?#19 N?#23 N?#24 N?#28 P?#5-P?#8 R?#14-R?#16 R?#38
触发比较器: N?#18 P?#9 P?#13-P?#16 R?#17 R?#44
输出: H?#2 N?#9 N?#11-N?#13 N?#22 N?#31 N?#33 N?#35 P?#12 P?#17 R?#18 R?#26 R?#31 R?#36 R?#37 R?#40

## Nets
+VREF: C?#9.2 C?#10.1 C?#16.1 C?#17.1 C?#18.1 C?#20.2 C?#21.2 D?#7.2(K) H?#3.2 H?#5.2 N?#9.3 N?#11.3 N?#42.3 P?#3.2(E) P?#4.2(E) R?#14.2 R?#15.2 R?#16.2 R?#17.2 R?#18.2 R?#19.2 R?#22.2 R?#53.2 R?#54.2 R?#55.2 R?#57.2 R?#58.2 R?#59.2 R?#60.2 R?#63.1 R?#64.2 U?.3(DRAIN)
GND: C?#8.2 N?#8.2 ZD?#7.2
GROGND: C?#3.2 C?#4.2 C?#5.2 C?#6.2 C?#7.2 C?#9.1 C?#10.2 C?#12.2 C?#13.2 C?#14.2 C?#16.2 C?#17.2 C?#18.2 C?#20.1 C?#21.1 C?#22.2 C?#23.2 H?#1.1 H?#1.2 N?#4.2 N?#22.2 N?#25.2 N?#27.2 N?#32.2 N?#35.2 N?#36.2 N?#39.2 N?#41.2 N?#45.2 N?#54.2 N?#56.2 N?#57.2 N?#58.2 N?#59.2 P?#5.3(C) P?#13.3(C) P?#15.3(C) P?#16.3(C) P?#18.3(C) P?#26.3(C) P?#27.3(C) Q?#2.2 Q?#3.2 R?#8.1 R?#9.1 R?#10.1 R?#38.1 R?#39.1 R?#40.1 R?#41.1 R?#44.1 R?#46.1 R?#49.1 R?#50.1 R?#51.1 R?#52.1 R?#56.1 R?#62.1 R?#66.1 R?#68.1 ZD?#11.1(A) ZD?#12.2
VC: R?#67.2
VCC: C?#1.1 C?#2.1 C?#3.1 C?#4.1 N?#1.1 Q?#1.2(S) R?#2.2 R?#4.2 R?#5.2 ZD?#1.1 ZD?#2.1 ZD?#3.1
FAULT: C?#22.1 D?#7.1(A) N?#53.1 N?#56.3 R?#63.2 R?#65.1
Iout1: H?#6.2 N?#49.1
NetC?#1_2: C?#1.2 R?#1.2
NetC?#2_2: C?#2.2 D?#1.2(K) N?#2.1 P?#1.1(B) Q?#2.3 Q?#3.3 R?#5.1
NetC?#5_1: C?#5.1 N?#5.1 Q?#2.1 R?#7.1 R?#9.2
NetC?#6_1: C?#6.1 N?#6.1 P?#1.3(C) Q?#3.1 R?#10.2
NetC?#7_1: C?#7.1 D?#1.1(A) N?#3.1 R?#4.1 ZD?#4.1
NetC?#8_1: C?#8.1 N?#7.1 P?#2.3 R?#11.2
NetC?#11_1: C?#11.1 P?#16.1(B) ZD?#8.2(K) ZD?#10.1(A)
NetC?#11_2: C?#11.2 C?#15.2 R?#41.2 ZD?#11.2(K)
NetC?#12_1: C?#12.1 N?#17.1 N?#18.1 R?#22.1 R?#33.2
NetC?#13_1: C?#13.1 C?#14.1 N?#14.2(C) N?#16.2(C) R?#20.2 R?#21.2 R?#24.2 R?#25.2 R?#27.2
NetC?#15_1: C?#15.1 H?#4.1 H?#4.2
NetC?#19_1: C?#19.1 N?#38.1 N?#40.3 R?#47.1
NetC?#19_2: C?#19.2 N?#38.3 N?#41.3 P?#18.1(B) R?#43.1
NetC?#23_1: C?#23.1 D?#6.1(A) N?#55.1 P?#26.1(B) R?#67.1 R?#68.2
NetD?#2_1: D?#2.1 N?#43.1 N?#45.3
NetD?#2_2: D?#2.2 R?#53.1
NetD?#3_1: D?#3.1(A) P?#21.3(C)
NetD?#3_2: D?#3.2(K) D?#5.2(K) P?#24.1(B) P?#27.2(E)
NetD?#4_1: D?#4.1(A) P?#20.3(C)
NetD?#4_2: D?#4.2(K) D?#6.2(K) P?#25.1(B) P?#26.2(E)
NetD?#5_1: D?#5.1(A) N?#52.1 P?#27.1(B) R?#64.1 R?#65.2 R?#66.2
NetH?#2_1: H?#2.1 N?#11.2 N?#22.3 P?#12.2(E) R?#26.1
NetH?#2_2: H?#2.2 N?#13.1
NetH?#3_1: H?#3.1 N?#14.3(E) N?#16.1(B) N?#16.3(E) N?#21.2 N?#26.1 N?#30.3 R?#30.1 R?#32.1 R?#32.2 R?#35.3
NetH?#5_1: H?#5.1 N?#42.1
NetH?#6_1: H?#6.1 N?#50.1 N?#51.1 N?#51.3 R?#61.1 U?.1(GATE)
NetN?#4_1: N?#4.1 R?#8.2 ZD?#4.2
NetN?#4_3: N?#4.3 R?#6.1
NetN?#8_1: N?#8.1 ZD?#6.2
NetN?#8_3: N?#8.3 R?#13.1 ZD?#7.1
NetN?#9_1: N?#9.1 N?#12.3 P?#12.1(B) P?#12.3(C) R?#18.1
NetN?#9_2: N?#9.2 N?#11.1 R?#26.2
NetN?#10_1: N?#10.1 N?#12.1 N?#25.3 P?#4.3(C) R?#29.2
NetN?#12_2: N?#12.2 R?#31.2 R?#37.2 R?#40.2
NetN?#14_1: N?#14.1(B) N?#21.3 N?#36.3 P?#11.3(C) P?#18.2(E) R?#43.2
NetN?#15_1: N?#15.1 R?#24.1 ZD?#12.1
NetN?#15_2: N?#15.2 R?#34.2
NetN?#15_3: N?#15.3 R?#25.1
NetN?#17_2: N?#17.2 N?#23.1
NetN?#17_3: N?#17.3 N?#23.3 P?#5.1(B) P?#6.1(B) P?#6.3(C)
NetN?#19_1: N?#19.1 R?#23.1 RTCT?.1 ZD?#10.2(K)
NetN?#19_2: N?#19.2 N?#24.1
NetN?#19_3: N?#19.3 N?#24.3 P?#7.1(B) P?#7.3(C) P?#8.1(B)
NetN?#20_1: N?#20.1 N?#20.3 P?#17.2(E) R?#28.1
NetN?#20_2: N?#20.2 N?#25.1 N?#27.3
NetN?#21_1: N?#21.1 R?#30.2 ZD?#9.2
NetN?#22_1: N?#22.1 R?#31.1
NetN?#23_2: N?#23.2 N?#24.2 R?#38.2
NetN?#26_2: N?#26.2 N?#34.3
NetN?#26_3: N?#26.3 N?#29.3 P?#10.1(B) P?#10.3(C) P?#11.1(B)
NetN?#27_1: N?#27.1 N?#32.3 P?#8.3(C) R?#29.1
NetN?#28_1: N?#28.1 P?#15.1(B) R?#33.1 R?#39.2
NetN?#29_1: N?#29.1 R?#34.1 R?#42.2
NetN?#29_2: N?#29.2 N?#34.2 N?#37.3 R?#45.1 R?#47.2 R?#48.2
NetN?#30_1: N?#30.1 R?#35.1 R?#35.2 R?#46.2
NetN?#30_2: N?#30.2 N?#34.1 R?#45.2
NetN?#31_1: N?#31.1 R?#36.1
NetN?#32_1: N?#32.1 P?#14.3(C) R?#44.2
NetN?#33_1: N?#33.1 N?#35.3 R?#19.1 R?#23.2 R?#23.3 ZD?#8.1(A)
NetN?#35_1: N?#35.1 P?#17.3(C) R?#37.1
NetN?#36_1: N?#36.1 R?#42.1 R?#49.2
NetN?#37_1: N?#37.1 N?#39.3 R?#48.1
NetN?#37_2: N?#37.2 N?#39.1 N?#40.1 R?#50.2
NetN?#38_2: N?#38.2 N?#41.1 R?#52.2
NetN?#40_2: N?#40.2 R?#51.2
NetN?#42_2: N?#42.2 ZD?#13.1(A)
NetN?#44_1: N?#44.1 N?#47.3 R?#55.1 ZD?#14.1
NetN?#45_1: N?#45.1 ZD?#14.2
NetN?#46_1: N?#46.1 N?#47.1 N?#48.3 R?#54.1
NetN?#47_2: N?#47.2 N?#48.2 R?#56.2
NetN?#48_1: N?#48.1 ZD?#13.2(K)
NetN?#49_2: N?#49.2 R?#62.2
NetN?#49_3: N?#49.3 P?#19.1(B) P?#20.1(B) P?#21.1(B) P?#22.1(B) P?#23.1(B) P?#23.3(C)
NetN?#51_2: N?#51.2 N?#54.1 N?#54.3
NetN?#56_1: N?#56.1 N?#57.3 P?#22.3(C)
NetN?#57_1: N?#57.1 N?#59.3 P?#24.3(C)
NetN?#58_1: N?#58.1 N?#58.3 N?#59.1 P?#25.3(C)
NetP?#1_2: P?#1.2(E) R?#3.1
NetP?#2_1: P?#2.1 R?#11.1 R?#13.2
NetP?#2_2: P?#2.2 R?#12.2
NetP?#3_1: P?#3.1(B) P?#3.3(C) P?#4.1(B) P?#9.1(B) R?#28.2
NetP?#5_2: P?#5.2(E) P?#8.2(E) R?#14.1
NetP?#6_2: P?#6.2(E) R?#15.1
NetP?#7_2: P?#7.2(E) R?#16.1
NetP?#9_2: P?#9.2(E) R?#17.1
NetP?#9_3: P?#9.3(C) P?#13.2(E) P?#14.2(E)
NetP?#10_2: P?#10.2(E) R?#20.1
NetP?#11_2: P?#11.2(E) R?#21.1
NetP?#13_1: P?#13.1(B) P?#15.2(E)
NetP?#14_1: P?#14.1(B) P?#16.2(E)
NetP?#17_1: P?#17.1(B) R?#36.2
NetP?#19_2: P?#19.2(E) R?#58.1
NetP?#19_3: P?#19.3(C) P?#24.2(E) P?#25.2(E)
NetP?#20_2: P?#20.2(E) P?#21.2(E) R?#60.1
NetP?#22_2: P?#22.2(E) R?#59.1
NetP?#23_2: P?#23.2(E) R?#57.1
NetQ?#1_1: Q?#1.1(G) R?#2.1 R?#6.2 ZD?#1.2
NetQ?#1_3: Q?#1.3(D) R?#1.1
NetR?#3_2: R?#3.2 ZD?#2.2
NetR?#7_2: R?#7.2 ZD?#3.2
NetR?#12_1: R?#12.1 ZD?#6.1
NetR?#27_1: R?#27.1 ZD?#9.1
NetR?#61_2: R?#61.2 U?.2(SOURCE)

Not connected (* = marked no-connect by the designer): D?#8 1(A) 2(K); ZD?#5 1 2

## Notes on the sheet
- (near C?#1) RC峰值吸收
- (near N?#1) 15.7V~28V(实测)
- 输入过压有滞回，欠压无滞回
- (near N?#1) V1
- V2
- (near ZD?#2) 过压释放阈值
- (near ZD?#3) 过压自锁阈值
- (near N?#2) V5
- 隔离二极管
- V3
- (near ZD?#4) 抬升二极管
- (near N?#5) V6
- 15V
- (near N?#6) V4
- (near ZD?#5) 击穿压降为1V（实测）
- 供电电压为15V，蓝色为VCC上电，黄色为V2处电压
- 前级电容上电稳定时间：10ms
- 后级电容上电上升时间：830us
- RC延时上电时间：7ms
- 供电电压为14V，欠压保护
- 双阈值电路
- 15V~18V
- 供电电压为15V，蓝色为VCC上电，电压上电达到19V时导通，钳位二极管为18V
- 电压降到16V时，后级停止供电
- NE555输出PWM：频率为80KHz，占空比为90
- 780X系列输出12V和5V电压
- (near R?#19) 调节频率
- 触发器输出测试点
- (near ZD?#8) 充电
- 放电
- (near P?#9) wilson电流镜
- 触发器比较输出
- (near H?#2) 输出
- (near N?#13) PWM输出测试点
- (near N?#15) 6.5V
- (near P?#10) 10.95V
- (near R?#23) 调节窄脉冲的宽度
- (near RTCT?) 三角波
- 比较器输出
- (near R?#29) 复位
- 外部时钟同步
- 比较器正端
- 阈值
- (near N?#17) 比较器负端
- (near R?#33) 2/3VCC
- (near N?#18) 阈值测试点
- (near N?#28) 触发测试点
- (near N?#28) 1/3VCC
- (near P?#16) 触发
- (near P?#15) 比较器正端
- (near R?#42) 2.75V
- 修改二：加了一个电容
- (near R?#44) 比较输出
- (near N?#32) 触发比较器输出
- 复位
- (near N?#31) 复位输出测试点
- 2.13V
- (near N?#33) 放电
- (near R?#45) 2.13V
- (near P?#18) Ic4
- f
- 1
- ≃
- 1.44
- (near N?#36) 0.434V
- F
- (R1 + 2R2) * C
- 100Khz
- 系统框图
- (near N?#40) 0.68V
- (near N?#38) Ic2
- (near N?#41) Ic3
- 黄色为12V转5输出电压，可调电阻实测阻值在1.18K
- 蓝色为20V转12V输出，可调电阻实测阻值在9.37K
- 5V欠压保护检测
- (near R?#54) 低阈值分压电阻
- (near R?#55) 高阈值分压电阻
- (near R?#56) 高低阈值下分压电阻
- 实测LED有1.8V压降
- 5V电压上升，欠压保护输出电压为3.4V
- 12V欠压保护检测
- 恒流源
- +
- (near P?#26) [N+]
- (near N?#52) -
- (near N?#52) [N-]
- (near R?#66) Vout​ =2.56V
- Vout​ =2.88V
- 比较器偏置电路
- 12V电压上升，欠压保护输出电压为3V
- (near D?#8) 实测有0.6V导通压降
- Labels drawn without touching a wire or pin: RT/CT

## Library data of the parts
C?#1 C?#2 C?#4-C?#7 = CAP_CC_SMD_5: 物料号: *; 物料描述: *
C?#3 C?#8 C?#14 C?#17 = CAP_EC_1: 贴片铝电解电容（RVT1V101M0607）; Part Number: *; Brand: *
C?#9 C?#19-C?#21 = C0603: Capacitor; Value: 104; Published: 8-Jun-2000; LatestRevisionDate: 17-Jul-2002; LatestRevisionNote: Re-released for DXP Platform.; Publisher: Altium Limited
C?#10-C?#13 C?#15 C?#16 C?#18 = CAP_CC_SMD_3: 物料号: *; 物料描述: *
C?#22 C?#23 = CAP_CC_SMD_4: 物料号: *; 物料描述: *
D?#1 ZD?#8 ZD?#10 ZD?#11 ZD?#13 = 1N4148WT: 二极管配置:独立式;整流电流:150mA;直流反向耐压(Vr):100V;正向压降(Vf):1.25V@150mA;反向恢复时间(Trr):4ns;; Manufacturer: R+O(宏嘉诚); Symbol: 1N4148WT_C7420320; AddInBom: yes; ModelId: 8f56a03db567494d8f4c9d12aa52a741; ModelName: SOD-523_L1.2-W0.8-H0.7-LS1.6; ModelTransform: 62.992,31.496,0,0,0,0,0,0,0; Diode Configuration: 独立式; Pd - Power Dissipation: 150mW; Current - Rectified: 150mA; Voltage - DC Reverse(Vr): 100V; Non-Repetitive Peak Forward Surge Current: 2A; Reverse Leakage Current (Ir): 1uA@75V; Reverse Recovery Time (trr): 4ns; Operating Junction Temperature Range: -55℃~+150℃; LCSC Part Name: 100V 150mA; SupplierPart: C7420320; ManufacturerPart: 1N4148WT; Supplier Footprint: SOD-523; JLCPCB Part Class: Extended Part; Datasheet: https://item.szlcsc.com/datasheet/1N4148WT/8397142.html; Supplier: LCSC; ConvertToPcb: yes; FootprintName: SOD-523_L1.2-W0.8-LS1.6-FD; Voltage - Forward(Vf@If): 1.25V@150mA
D?#2 = DIO_LED: Brand: LED; Part Number: *
D?#3-D?#8 = 1N4148WT: 二极管配置:独立式;整流电流:150mA;直流反向耐压(Vr):100V;正向压降(Vf):1.25V@150mA;反向恢复时间(Trr):4ns;; Manufacturer: R+O(宏嘉诚); Symbol: 1N4148WT_C7420320; AddInBom: yes; ModelId: 8f56a03db567494d8f4c9d12aa52a741; ModelName: SOD-523_L1.2-W0.8-H0.7-LS1.6; ModelTransform: 62.992,31.496,0,0,0,0,0,0,0; Voltage - DC Reverse(Vr): 100V; Current - Rectified: 150mA; Non-Repetitive Peak Forward Surge Current: 2A; Diode Configuration: 独立式; Pd - Power Dissipation: 150mW; Reverse Leakage Current (Ir): 1uA@75V; Reverse Recovery Time (trr): 4ns; Operating Junction Temperature Range: -55℃~+150℃; LCSC Part Name: 100V 150mA; SupplierPart: C7420320; ManufacturerPart: 1N4148WT; Supplier Footprint: SOD-523; JLCPCB Part Class: Extended Part; Datasheet: https://item.szlcsc.com/datasheet/1N4148WT/8397142.html; Supplier: LCSC; ConvertToPcb: yes; FootprintName: SOD-523_L1.2-W0.8-LS1.6-FD; Voltage - Forward(Vf@If): 1.25V@150mA
H?#1-H?#6 = pz254v-11-02p: 插针结构:1x2P;间距:2.54mm;行距:-;圆针/方针:方针;安装方式:直插;排数:单排;总PIN位数:2P;额定电流:3A;额定电压:250V;配合针长度:6mm;塑高:2.5mm;端接针长度:3mm;触头材质:黄铜;触头镀层:-;工作温度:-40℃~+105℃;颜色:黑色;; Manufacturer: XFCN(兴飞); AddInBom: yes; ModelId: e35305ec3aa84b66b849f914b715e73f; ModelName: HDR2.54-M-LI-1X2P; ModelTransform: 200,100,0,0,0,0,0,0,-118.11; Pin Structure: 1x2P; Pitch: 2.54mm; Circluar Pins/Square Pins: 方针; Current Rating: 3A; Voltage Rating (Max): 250V; Symbol: PZ254V-11-02P; LCSC Part Name: 1x2P 间距:2.54mm 方针 直插; SupplierPart: C492401; ManufacturerPart: PZ254V-11-02P; Supplier Footprint: 插件,P=2.54mm; JLCPCB Part Class: Extended Part; Datasheet: https://item.szlcsc.com/datasheet/PZ254V-11-02P/502957.html; Supplier: LCSC; ConvertToPcb: yes; FootprintName: HDR-TH_2P-P2.54-V-M; Row Spacing: -; Mounting Type: 直插; Number of Rows: 单排; Number of Pins: 2P; Length of Mating Pin: 6mm; Insulation Height: 2.5mm; Length of End Connection Pin: 3mm; Contact Material: 黄铜; Contact Plating: -; Operating Temperature: -40℃~+105℃; Color: 黑色
N?#1-N?#3 N?#5-N?#7 N?#10 N?#13 N?#18 N?#28 N?#31 N?#33 N?#43 N?#44 N?#46 N?#50 N?#52 N?#53 N?#55 RTCT? = 测试点: value: *
N?#14 N?#16 = 2sd882_c90797: 晶体管类型:NPN;集电极电流(Ic):3A;集射极击穿电压(Vceo):30V;耗散功率(Pd):12.5W;直流电流增益(hFE):100@1A,2V;; Manufacturer: ST(意法半导体); AddInBom: yes; ModelId: 5d8cc27ca8d54406b5fd11c1efd06fe1; ModelTransform: 299.212,104.724,0,180,0,0,0,7.874,-196.85; Current - Collector(Ic): 3A; Collector - Emitter Voltage VCEO: 30V; Pd - Power Dissipation: 12.5W; Transition frequency(fT): 100MHz; Current - Collector Cutoff: 100uA; Vce Saturation(VCE(sat)): 400mV; Symbol: 2SD882; LCSC Part Name: NPN 电流:3A 电压:30V; SupplierPart: C90797; ManufacturerPart: 2SD882; Supplier Footprint: TO-126; JLCPCB Part Class: Extended Part; Datasheet: https://item.szlcsc.com/datasheet/2SD882/91985.html; Supplier: LCSC; ConvertToPcb: yes; FootprintName: TO-126-3_L7.6-W2.7-P2.29-R; ModelName: TO-126-3_L7.6-W2.7-P2.29-R; type: NPN; DC Current Gain: 100@1A,2V; Operating Temperature: -65℃~+150℃
P?#2 = BJT_PNP: PNP/30V/3A; Part Number: *; Brand: *
Q?#1 = do4085a: 数量:1个P沟道;漏源电压(Vdss):40V;连续漏极电流(Id):5A;导通电阻(RDS(on)):90mΩ@10V;耗散功率(Pd):3.8W;阈值电压(Vgs(th)):2.5V;; Manufacturer: DOINGTER(杜因特); AddInBom: yes; ModelId: 89cb27a44ab2466697082bb9fd73a7d0; ModelName: SOT-23-3L_L2.9-W1.6-H1.1-LS2.8-P0.95; ModelTransform: 114.173,110.236,0,90,0,0,0,0,0; Number: 1个P沟道; Drain to Source Voltage: 40V; Current - Continuous Drain(Id): 5A; Pd - Power Dissipation: 3.8W; Gate Threshold Voltage (Vgs(th)): 2.5V; Gate Charge(Qg): 7nC@10V; Input Capacitance(Ciss): 570pF; Reverse Transfer Capacitance (Crss@Vds): 40pF; Type: P沟道; Output Capacitance(Coss): 50pF; Symbol: DO4085A; LCSC Part Name: P沟道MOSFET; SupplierPart: C47018569; ManufacturerPart: DO4085A; Supplier Footprint: SOT-23; JLCPCB Part Class: Extended Part; Datasheet: https://item.szlcsc.com/datasheet/DO4085A/49200335.html; Supplier: LCSC; ConvertToPcb: yes; FootprintName: SOT-23-3_L2.9-W1.6-P1.90-LS2.8-BR; RDS(on): 90mΩ@10V; Operating Temperature: -55℃~+150℃
R?#1-R?#10 R?#13 = R-0603-100Ω-5%_20: 片式电阻; 物料描述: 片式电阻器-0805-10KΩ-5%-JT; 物料号: NA
R?#11 R?#12 R?#14-R?#18 R?#20-R?#22 R?#24-R?#34 R?#36-R?#40 R?#42-R?#52 = R-0603-100Ω-5%_2: 片式电阻; 物料描述: 片式电阻器-0805-10KΩ-5%-JT; 物料号: NA
R?#19 R?#41 R?#53-R?#56 = R-0603-100Ω-5%_4: 片式电阻; 物料描述: 片式电阻器-0805-10KΩ-5%-JT; 物料号: NA
R?#23 R?#35 = 3296w-1-202lf: 阻值:2kΩ;精度:±10%;功率:500mW;温度系数:±100ppm/℃;; Manufacturer: BOURNS; Symbol: 3296W-1-202LF_C83684; AddInBom: yes; ModelId: 3664f7b541aa4725a8b6d3b7a961f078; ModelTransform: 374.015,188.976,0,90,0,0,2.362,0.005,-137.795; Value: 2kΩ; Tolerance: ±10%; Power(Watts): 500mW; Number of Turns: 25; LCSC Part Name: 2kΩ ±10%; SupplierPart: C83684; ManufacturerPart: 3296W-1-202LF; Supplier Footprint: SIP-3P,9.5x4.8mm; JLCPCB Part Class: Extended Part; Datasheet: https://item.szlcsc.com/datasheet/3296W-1-202LF/84850.html; Supplier: LCSC; ConvertToPcb: yes; FootprintName: RES-ADJ-TH_3296W; ModelName: RES-ADJ-TH_3296W; Temperature Coefficient: ±100ppm/℃
R?#57-R?#60 R?#62 = R-0603-100Ω-5%_13: 片式电阻; 物料描述: 片式电阻器-0805-10KΩ-5%-JT; 物料号: NA
R?#61 = R-0603-100Ω-5%_16: 片式电阻; 物料描述: 片式电阻器-0805-10KΩ-5%-JT; 物料号: NA
R?#63-R?#66 = R-0603-100Ω-5%_10: 片式电阻; 物料描述: 片式电阻器-0805-10KΩ-5%-JT; 物料号: NA
R?#67 R?#68 = R-0603-100Ω-5%_7: 片式电阻; 物料描述: 片式电阻器-0805-10KΩ-5%-JT; 物料号: NA
U? = bf256b: 数量:1个N沟道;栅源击穿电压(Vgss):30V;耗散功率(Pd):350mW;导通电阻(RDS(on)):-;漏源电流(Idss):13mA;; Manufacturer: onsemi(安森美); AddInBom: yes; ModelId: 4ec6837dedfb4578a434f76110365bf1; ModelTransform: 180.3146,140.1572,0,180,0,0,0,23.465,-196.85; Number: 1个N沟道; Gate-Source Cutoff Voltage (VGS(off)): 500mV; Gate-Source Breakdown Voltage (Vgss): 30V; Pd - Power Dissipation: 350mW; Drain Current (Idss): 13mA; FET Type: N沟道; Symbol: BF256B; LCSC Part Name: 1个N沟道 500mV@10nA; SupplierPart: C2892081; ManufacturerPart: BF256B; Supplier Footprint: TO-92-3; JLCPCB Part Class: Extended Part; Datasheet: https://item.szlcsc.com/datasheet/BF256B/3122554.html; Supplier: LCSC; ConvertToPcb: yes; FootprintName: TO-92-3_L4.6-W3.9-P1.27-L; ModelName: TO-92-3_L4.6-W3.9-P1.27-L; RDS(on): -; Ciss-Input Capacitance: -; Operating Temperature: -55℃~+150℃; Configuration: -; Output Capacitance(Coss): -; Reverse Transfer Capacitance (Crss): -
ZD?#1-ZD?#7 ZD?#9 ZD?#14 = DIO_ZENER_2: 15V稳压管; Brand: 10V; Part Number: *
ZD?#12 = DIO_ZENER_5: 18V稳压管; Brand: 10V; Part Number: *
N?#4 N?#8 N?#9 N?#11 N?#12 N?#15 N?#17 N?#19-N?#27 N?#29 N?#30 N?#32 N?#34-N?#42 N?#45 N?#47-N?#49 N?#51 N?#54 N?#56-N?#59 Q?#2 Q?#3 = MMTB3904: Part Number: *; Brand: *
P?#1 P?#3-P?#27 = MMBT3906: Part Number: *; Brand: *